# Altium project IoT_SYNTHPATCH.PrjPcb
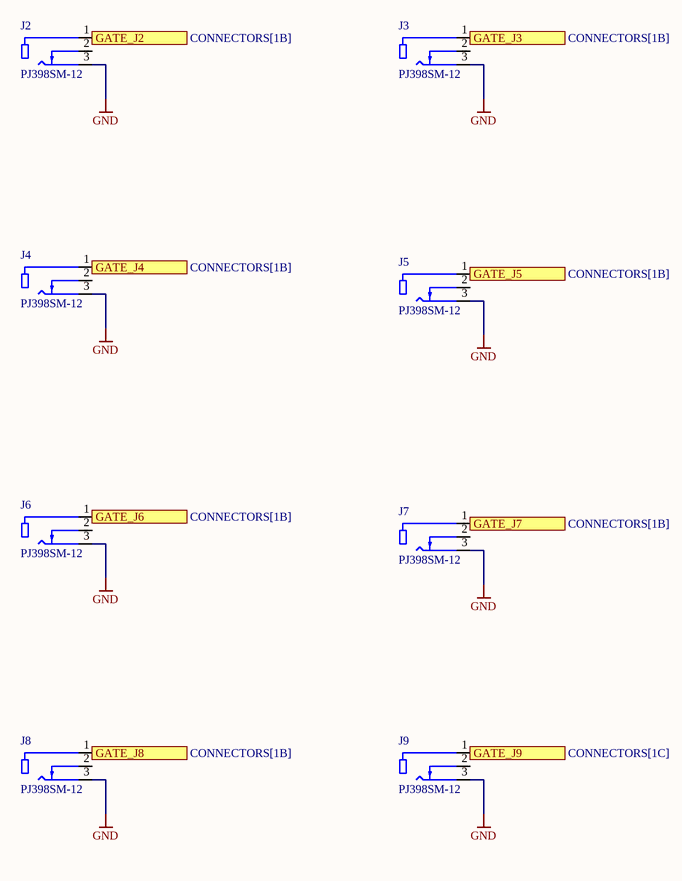
[diagram p0: INPUTS_GATES.SchDoc]
12 sheets, 198 parts. Net scope: flat (ports and power ports of the same name join across sheets).
Board file: IoT_SYNTHPATCH.PcbDoc
Sheets:
  INPUTS_GATES.SchDoc
  DAC_LFO.SchDoc
  DAC_VOCT.SchDoc
  Main.SchDoc
  MUTE_BUTTONS.SchDoc
  MIDI.SchDoc
  DISPLAY.SchDoc
  POWER.SchDoc
  ADC.SchDoc
  POWER_CONNECTOR.SchDoc
  MENU_BUTTONS.SchDoc
  CONNECTORS.SchDoc

## Sheet INPUTS_GATES.SchDoc
size A4; SheetNumber: 1; SheetTotal: 12

### Parts
J2  PJ398SM-12  [THONK_PJ398SM-12]
J3  PJ398SM-12  [THONK_PJ398SM-12]
J4  PJ398SM-12  [THONK_PJ398SM-12]
J5  PJ398SM-12  [THONK_PJ398SM-12]
J6  PJ398SM-12  [THONK_PJ398SM-12]
J7  PJ398SM-12  [THONK_PJ398SM-12]
J8  PJ398SM-12  [THONK_PJ398SM-12]
J9  PJ398SM-12  [THONK_PJ398SM-12]

### Ports
GATE_J2 (see CONNECTORS[1B]), GATE_J3 (see CONNECTORS[1B]), GATE_J4 (see CONNECTORS[1B]), GATE_J5 (see CONNECTORS[1B]), GATE_J6 (see CONNECTORS[1B]), GATE_J7 (see CONNECTORS[1B]), GATE_J8 (see CONNECTORS[1B]), GATE_J9 (see CONNECTORS[1C])

### Nets
GND: J2.3 J3.3 J4.3 J5.3 J6.3 J7.3 J8.3 J9.3
GATE_J2: J2.1 ; port GATE_J2
GATE_J3: J3.1 ; port GATE_J3
GATE_J4: J4.1 ; port GATE_J4
GATE_J5: J5.1 ; port GATE_J5
GATE_J6: J6.1 ; port GATE_J6
GATE_J7: J7.1 ; port GATE_J7
GATE_J8: J8.1 ; port GATE_J8
GATE_J9: J9.1 ; port GATE_J9

Not connected (* = marked no-connect by the designer): J2 2; J3 2; J4 2; J5 2; J6 2; J7 2; J8 2; J9 2

### Library data of the parts
J2-J9 = PJ398SM-12: 3.5mm Switching Jack Socket; MF: Thonk; Availability: Not in stock; Price: None; Package: Package; MP: PJ398SM-12; Value: *

## Sheet DAC_LFO.SchDoc
size A3; SheetNumber: 2; SheetTotal: 12
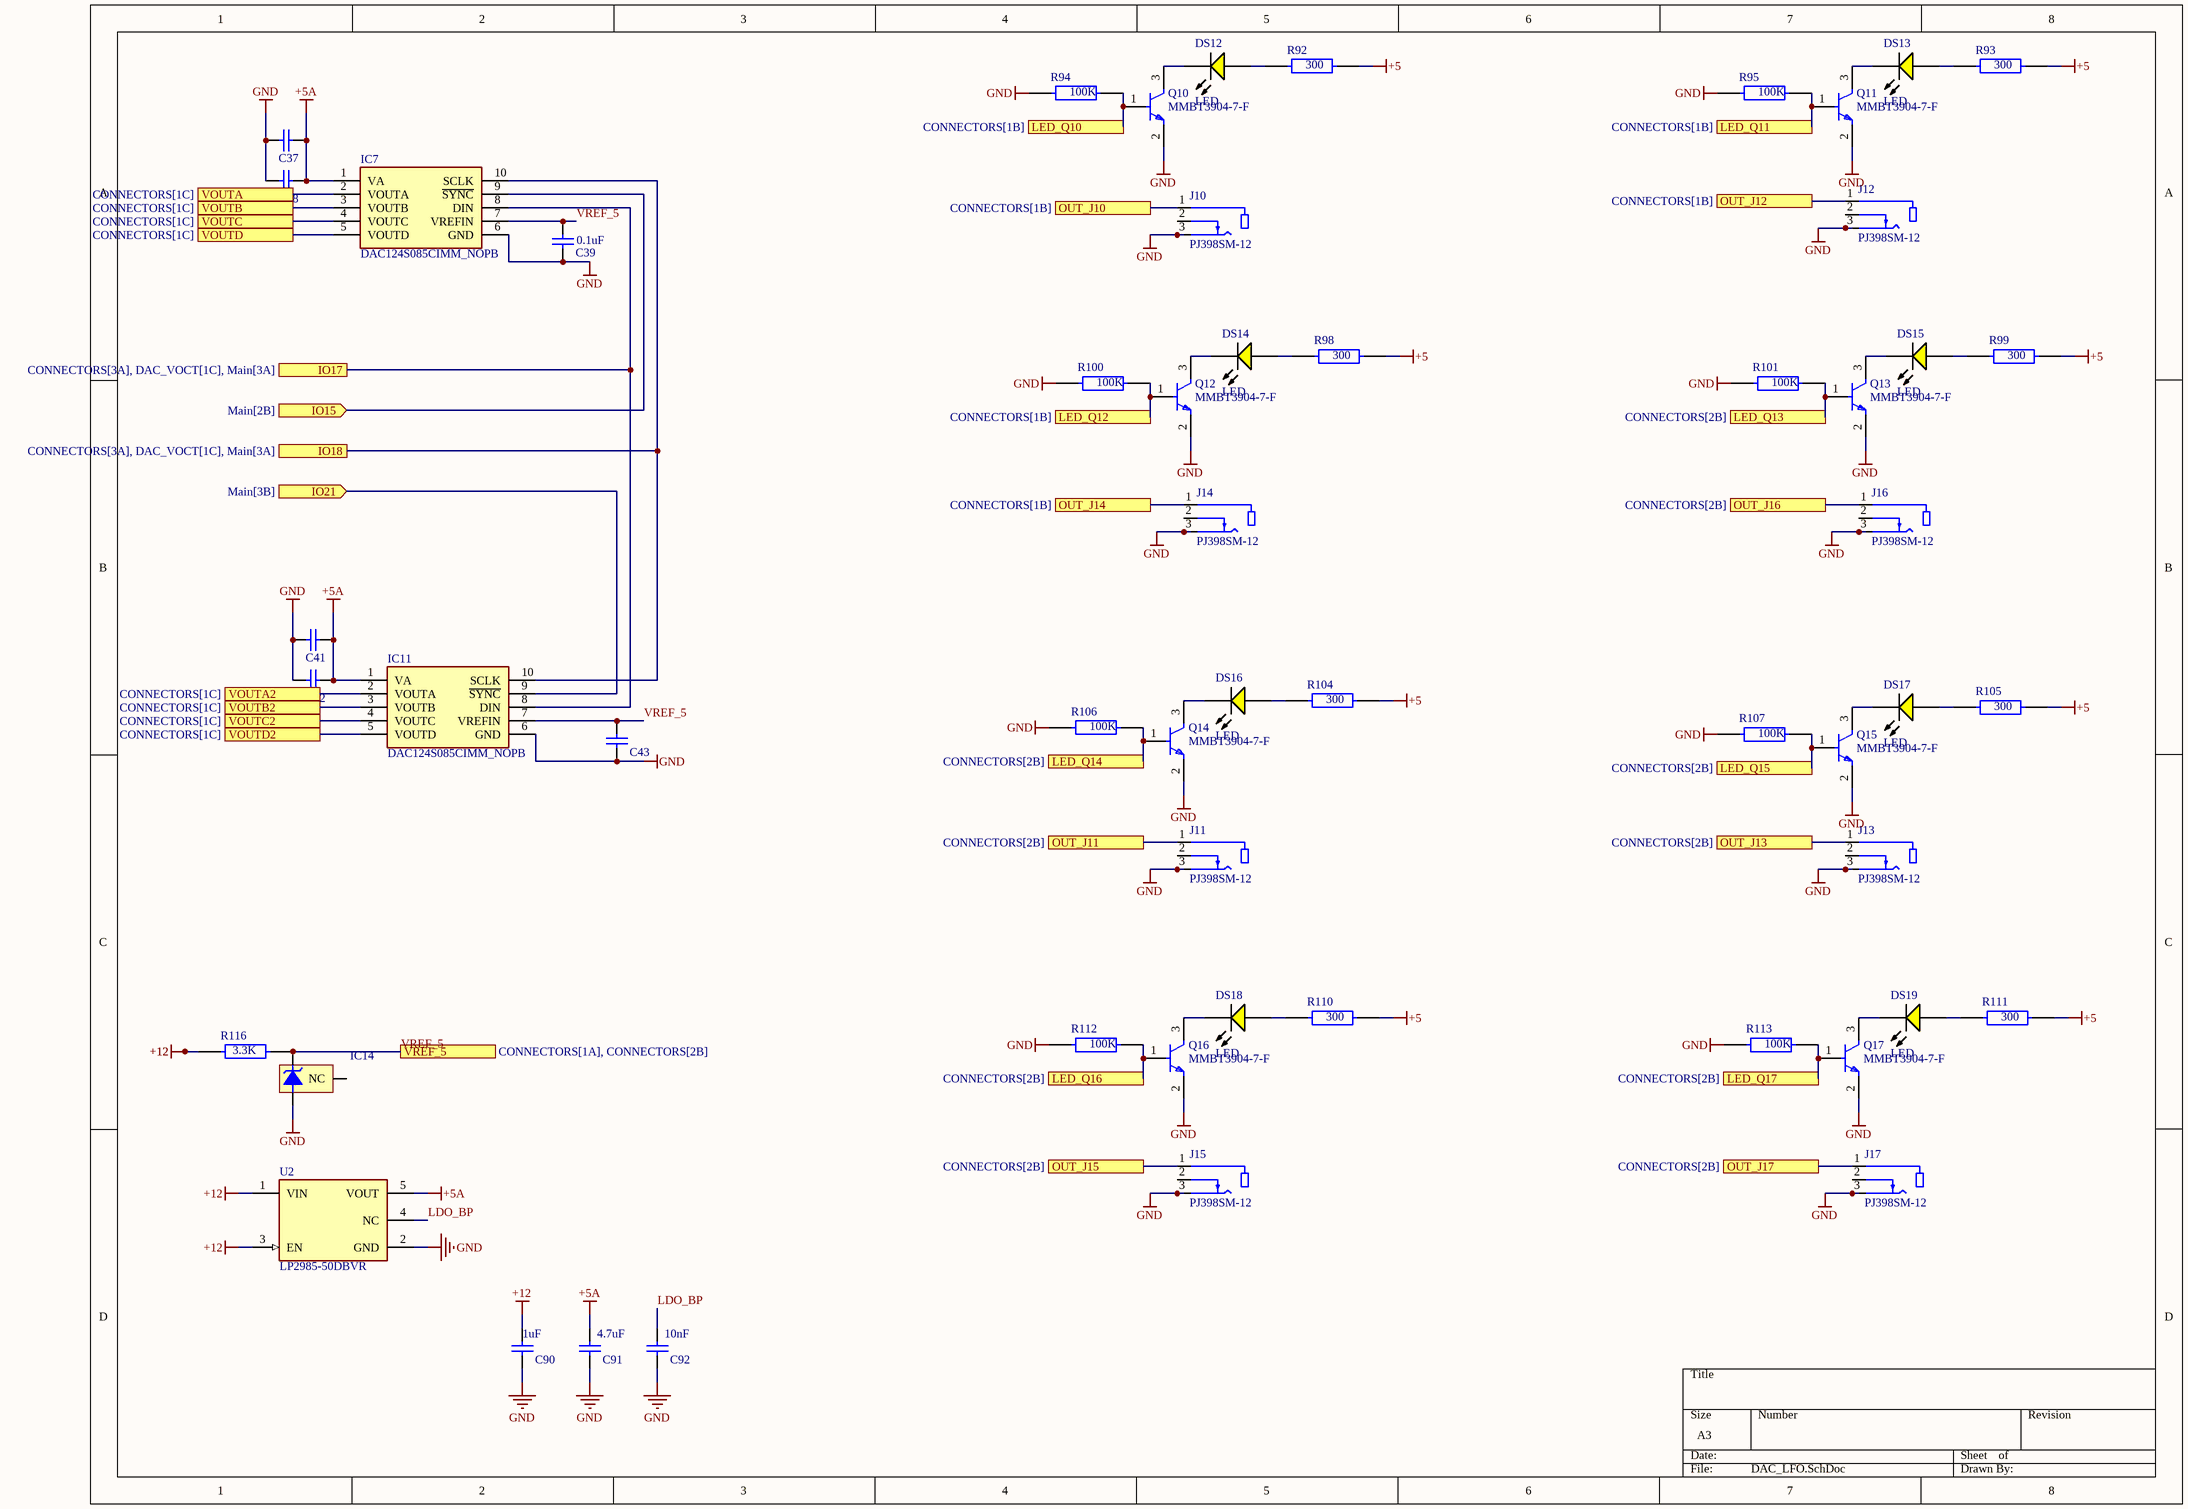
[diagram p1: DAC_LFO.SchDoc]

### Parts
C37  10uF  [CAPC2013X145X48NL20T23]  (value not drawn)
C38  0.1uF  [CAPC2013X145X48NL20T23]  (value not drawn)
C39  0.1uF  [CAPC2013X145X48NL20T23]
C41  10uF  [CAPC2013X145X48NL20T23]  (value not drawn)
C42  0.1uF  [CAPC2013X145X48NL20T23]  (value not drawn)
C43  0.1uF  [CAPC2013X145X48NL20T23]  (value not drawn)
C90  1uF  [CAPC2013X145X48NL20T23]
C91  4.7uF  [CAPC2013X145X48NL20T23]
C92  10nF  [CAPC2013X145X48NL20T23]
DS12  LED  [LED_SSL-LX4673GD-LA20]
DS13  LED  [LED_SSL-LX4673GD-LA20]
DS14  LED  [LED_SSL-LX4673GD-LA20]
DS15  LED  [LED_SSL-LX4673GD-LA20]
DS16  LED  [LED_SSL-LX4673GD-LA20]
DS17  LED  [LED_SSL-LX4673GD-LA20]
DS18  LED  [LED_SSL-LX4673GD-LA20]
DS19  LED  [LED_SSL-LX4673GD-LA20]
IC7  DAC124S085CIMM_NOPB  [SOP50P490X110-10N]
IC11  DAC124S085CIMM_NOPB  [SOP50P490X110-10N]
IC14  LM4040CEM3-5.0/NOPB  [MF03A_L]  (value not drawn)
J10  PJ398SM-12  [THONK_PJ398SM-12]
J11  PJ398SM-12  [THONK_PJ398SM-12]
J12  PJ398SM-12  [THONK_PJ398SM-12]
J13  PJ398SM-12  [THONK_PJ398SM-12]
J14  PJ398SM-12  [THONK_PJ398SM-12]
J15  PJ398SM-12  [THONK_PJ398SM-12]
J16  PJ398SM-12  [THONK_PJ398SM-12]
J17  PJ398SM-12  [THONK_PJ398SM-12]
Q10  MMBT3904-7-F  [3904-SOT23]
Q11  MMBT3904-7-F  [3904-SOT23]
Q12  MMBT3904-7-F  [3904-SOT23]
Q13  MMBT3904-7-F  [3904-SOT23]
Q14  MMBT3904-7-F  [3904-SOT23]
Q15  MMBT3904-7-F  [3904-SOT23]
Q16  MMBT3904-7-F  [3904-SOT23]
Q17  MMBT3904-7-F  [3904-SOT23]
R92  300  [FP-RN73R2A-IPC_A]
R93  300  [FP-RN73R2A-IPC_A]
R94  100K  [FP-RN73R2A-IPC_A]
R95  100K  [FP-RN73R2A-IPC_A]
R98  300  [FP-RN73R2A-IPC_A]
R99  300  [FP-RN73R2A-IPC_A]
R100  100K  [FP-RN73R2A-IPC_A]
R101  100K  [FP-RN73R2A-IPC_A]
R104  300  [FP-RN73R2A-IPC_A]
R105  300  [FP-RN73R2A-IPC_A]
R106  100K  [FP-RN73R2A-IPC_A]
R107  100K  [FP-RN73R2A-IPC_A]
R110  300  [FP-RN73R2A-IPC_A]
R111  300  [FP-RN73R2A-IPC_A]
R112  100K  [FP-RN73R2A-IPC_A]
R113  100K  [FP-RN73R2A-IPC_A]
R116  3.3K  [FP-RN73R2A-IPC_A]
U2  LP2985-50DBVR  [FP-SOT25-IPC_A]

### Ports
IO15 (in, see Main[2B]), IO17 (see CONNECTORS[3A], DAC_VOCT[1C], Main[3A]), IO18 (see CONNECTORS[3A], DAC_VOCT[1C], Main[3A]), IO21 (in, see Main[3B]), LED_Q10 (see CONNECTORS[1B]), LED_Q11 (see CONNECTORS[1B]), LED_Q12 (see CONNECTORS[1B]), LED_Q13 (see CONNECTORS[2B]), LED_Q14 (see CONNECTORS[2B]), LED_Q15 (see CONNECTORS[2B]), LED_Q16 (see CONNECTORS[2B]), LED_Q17 (see CONNECTORS[2B]), OUT_J10 (see CONNECTORS[1B]), OUT_J11 (see CONNECTORS[2B]), OUT_J12 (see CONNECTORS[1B]), OUT_J13 (see CONNECTORS[2B]), OUT_J14 (see CONNECTORS[1B]), OUT_J15 (see CONNECTORS[2B]), OUT_J16 (see CONNECTORS[2B]), OUT_J17 (see CONNECTORS[2B]), VOUTA2 (see CONNECTORS[1C]), VOUTA (see CONNECTORS[1C]), VOUTB2 (see CONNECTORS[1C]), VOUTB (see CONNECTORS[1C]), VOUTC2 (see CONNECTORS[1C]), VOUTC (see CONNECTORS[1C]), VOUTD2 (see CONNECTORS[1C]), VOUTD (see CONNECTORS[1C]), VREF_5 (see CONNECTORS[1A], CONNECTORS[2B])

### Nets
+5: R92.1 R93.1 R98.1 R99.1 R104.1 R105.1 R110.1 R111.1
+5A: C37.2 C38.2 C41.2 C42.2 C91.2 IC7.1(VA) IC11.1(VA) U2.5(VOUT)
+12: C90.2 R116.1 U2.1(VIN) U2.3(EN)
GND: C37.1 C38.1 C39.1 C41.1 C42.1 C43.1 C90.1 C91.1 C92.1 IC7.6(GND) IC11.6(GND) IC14.2(-V) J10.3 J11.3 J12.3 J13.3 J14.3 J15.3 J16.3 J17.3 Q10.2(E) Q11.2(E) Q12.2(E) Q13.2(E) Q14.2(E) Q15.2(E) Q16.2(E) Q17.2(E) R94.2 R95.2 R100.2 R101.2 R106.2 R107.2 R112.2 R113.2 U2.2(GND)
IO15: IC7.9(~{SYNC}) ; port IO15
IO17: IC7.8(DIN) IC11.8(DIN) ; port IO17
IO18: IC7.10(SCLK) IC11.10(SCLK) ; port IO18
IO21: IC11.9(~{SYNC}) ; port IO21
LDO_BP: C92.2 U2.4(NC)
LED_Q10: Q10.1(B) R94.1 ; port LED_Q10
LED_Q11: Q11.1(B) R95.1 ; port LED_Q11
LED_Q12: Q12.1(B) R100.1 ; port LED_Q12
LED_Q13: Q13.1(B) R101.1 ; port LED_Q13
LED_Q14: Q14.1(B) R106.1 ; port LED_Q14
LED_Q15: Q15.1(B) R107.1 ; port LED_Q15
LED_Q16: Q16.1(B) R112.1 ; port LED_Q16
LED_Q17: Q17.1(B) R113.1 ; port LED_Q17
OUT_J10: J10.1 ; port OUT_J10
OUT_J11: J11.1 ; port OUT_J11
OUT_J12: J12.1 ; port OUT_J12
OUT_J13: J13.1 ; port OUT_J13
OUT_J14: J14.1 ; port OUT_J14
OUT_J15: J15.1 ; port OUT_J15
OUT_J16: J16.1 ; port OUT_J16
OUT_J17: J17.1 ; port OUT_J17
VOUTA: IC7.2(VOUTA) ; port VOUTA
VOUTA2: IC11.2(VOUTA) ; port VOUTA2
VOUTB: IC7.3(VOUTB) ; port VOUTB
VOUTB2: IC11.3(VOUTB) ; port VOUTB2
VOUTC: IC7.4(VOUTC) ; port VOUTC
VOUTC2: IC11.4(VOUTC) ; port VOUTC2
VOUTD: IC7.5(VOUTD) ; port VOUTD
VOUTD2: IC11.5(VOUTD) ; port VOUTD2
VREF_5: C39.2 C43.2 IC7.7(VREFIN) IC11.7(VREFIN) IC14.1(+V) R116.2 ; port VREF_5
NetDS12_1: DS12.1(A) R92.2
NetDS12_2: DS12.2(K) Q10.3(C)
NetDS13_1: DS13.1(A) R93.2
NetDS13_2: DS13.2(K) Q11.3(C)
NetDS14_1: DS14.1(A) R98.2
NetDS14_2: DS14.2(K) Q12.3(C)
NetDS15_1: DS15.1(A) R99.2
NetDS15_2: DS15.2(K) Q13.3(C)
NetDS16_1: DS16.1(A) R104.2
NetDS16_2: DS16.2(K) Q14.3(C)
NetDS17_1: DS17.1(A) R105.2
NetDS17_2: DS17.2(K) Q15.3(C)
NetDS18_1: DS18.1(A) R110.2
NetDS18_2: DS18.2(K) Q16.3(C)
NetDS19_1: DS19.1(A) R111.2
NetDS19_2: DS19.2(K) Q17.3(C)

Not connected (* = marked no-connect by the designer): IC14 3(NC); J10 2; J11 2; J12 2; J13 2; J14 2; J15 2; J16 2; J17 2

### Library data of the parts
C37-C39 C41-C43 C90-C92 = CAP: Manufacturer: Vitramon; Part Number: VJ0805Y682KXAMT
DS12-DS19 = LED-Y: Through Hole Lamp, 2.1 V, -55 to 100 degC, 2-Pin THD, RoHS, Bulk; Luminous Intensity: 200 mcd; Illumination Colour: White; Power Rating: 78 mW; Viewing Angle: 140 degrees; Lens Style: Diffused; Nominal Vf: 3.6 V; Case\Package: 0603; Forward Current: 20 mA; Colour: White; Pins: 2; Mount: Surface Mount; Min Operating Temperature: -40 degC; Radiation Hardening: No; Width: 0.8 mm; PackageDescription: 2-Pin Through Hole Device, Dia 3.8 mm, Pitch 2.54 mm; REACH SVHC: No SVHC; DatasheetVersion: Rev. B, 07/2013; Max Operating Temperature: 85 degC; PackageReference: LTL-1CHYE; ComponentLink2URL: https://datasheet.ciiva.com/4269/s-110-ltl-1chye-4269126.pdf; ComponentLink1URL: http://www.us.liteon.com/; Case Code (Imperial): 0603; Height: 0.6 mm; Packaging: Tape and Reel; ComponentLink2Description: Datasheet; Length: 1.6 mm; Package Quantity: 4000; RoHSCompliant: true; ComponentLink1Description: Manufacturer URL; Case Code (Metric): 1608; Forward Voltage: 3.6 V
IC7 IC11 = DAC124S085CIMM_NOPB: 12-Bit Micro Power QUAD Digital-to-Analog Converter with Rail-to-Rail Output; Manufacturer_Name: Texas Instruments; Manufacturer_Part_Number: DAC124S085CIMM/NOPB; Geometry.Height: 1.1mm; Mouser Part Number: 926-DAC124S085CIMMNO; Mouser Price/Stock: https://www.mouser.co.uk/ProductDetail/Texas-Instruments/DAC124S085CIMM-NOPB?qs=7X5t%252BdzoRHBv34DgWfHrUA%3D%3D; Datasheet Link: http://www.ti.com/lit/gpn/dac124s085
IC14 = lm4040: Precision Micropower Shunt Voltage Reference, 3-pin SOT-23, Pb-Free; Manufacturer: National Semiconductor; PackageTopMarking: R5C*XTT; PowerWise: N; CompType: Voltage Reference IC; ComponentLink1URL: http://www.national.com/ds/LM/LM4040.pdf; PinCount: 3; ComponentLink2Description: LM4040 Web Page; ComponentLink3URL: http://www.national.com/packaging/folders/mf03a.html; RevisionNote: Component URLs added; PackageVersion: revB, Mar-2003; ComponentLink2URL: http://www.national.com/pf/LM/LM4040.html; ComponentLink3Description: MF03A Package Page; PackageReference: MF03A; RoHS: Y; DatasheetVersion: Apr-2005; PackageDescription: Molded SOT-23, .115 x .051 x .037in Body, 3 Lead, .075 in Pitch; ComponentLink1Description: LM4040 Datasheet
J10-J17 = PJ398SM-12: 3.5mm Switching Jack Socket; MF: Thonk; Availability: Not in stock; Price: None; Package: Package; MP: PJ398SM-12; Value: *
Q10-Q17 = 3904: TRANS NPN 40V 0.2A SMD SOT23-3; Frequency: 300MHz; Power Dissipation: 350mW; Element Configuration: Single; Max Power Dissipation: 300mW; Max Collector Current: 200mA; Collector Emitter Saturation Voltage: 300mV; Number of Elements: 1; hFE Min: 100; Collector Base Voltage (VCBO): 60V; Emitter Base Voltage (VEBO): 6V; Contact Plating: Tin; Package Quantity: 3000; Max Frequency: 300MHz; REACH SVHC: No SVHC; Max Operating Temperature: 150°C; Width: 1.4mm; Collector Emitter Voltage (VCEO): 40V; Voltage Rating (DC): 40V; Radiation Hardening: No; Case/Package: SOT-23; Height: 1mm; Collector Emitter Breakdown Voltage: 40V; Length: 3.05mm; Polarity: NPN; Packaging: Tape and Reel; Number of Pins: 3; Min Operating Temperature: -55°C; Gain Bandwidth Product: 300MHz; Mount: Surface Mount; Weight: 0.000282oz; Continuous Collector Current: 200mA; Transition Frequency: 300MHz; Max Breakdown Voltage: 40V; Lead Free: Lead Free
R92-R95 R98-R101 R104-R107 R110-R113 R116 = Resistor: RES 10K OHM 0.1% 1/8W 0805
U2 = CMP-12756-000035-1: Low-noise LDO 5.0 V 150 mA, SOT-23-5 (DAC supply +5A); Number of Regulators: 1; Output Current: 600mA; Output Type: Fixed; Polarity: Positive; Min Input Voltage: 2.5V; Output Voltage: 3.3V; Max Input Voltage: 6V; Accuracy: 1.5%; Quiescent Current: 55uA; Dropout Voltage: 250mV; Min Operating Temperature: -40°C; Length: 3.1mm; Max Operating Temperature: 85°C; Package Quantity: 1; Width: 1.7mm; Number of Outputs: 1; Packaging: Tape and Reel; Height: 1.3mm; Lead Free: Lead Free; Max Output Current: 600mA; Case/Package: SOT-23-5; Mount: Surface Mount; Number of Pins: 5

## Sheet DAC_VOCT.SchDoc
size A4; SheetNumber: 3; SheetTotal: 12
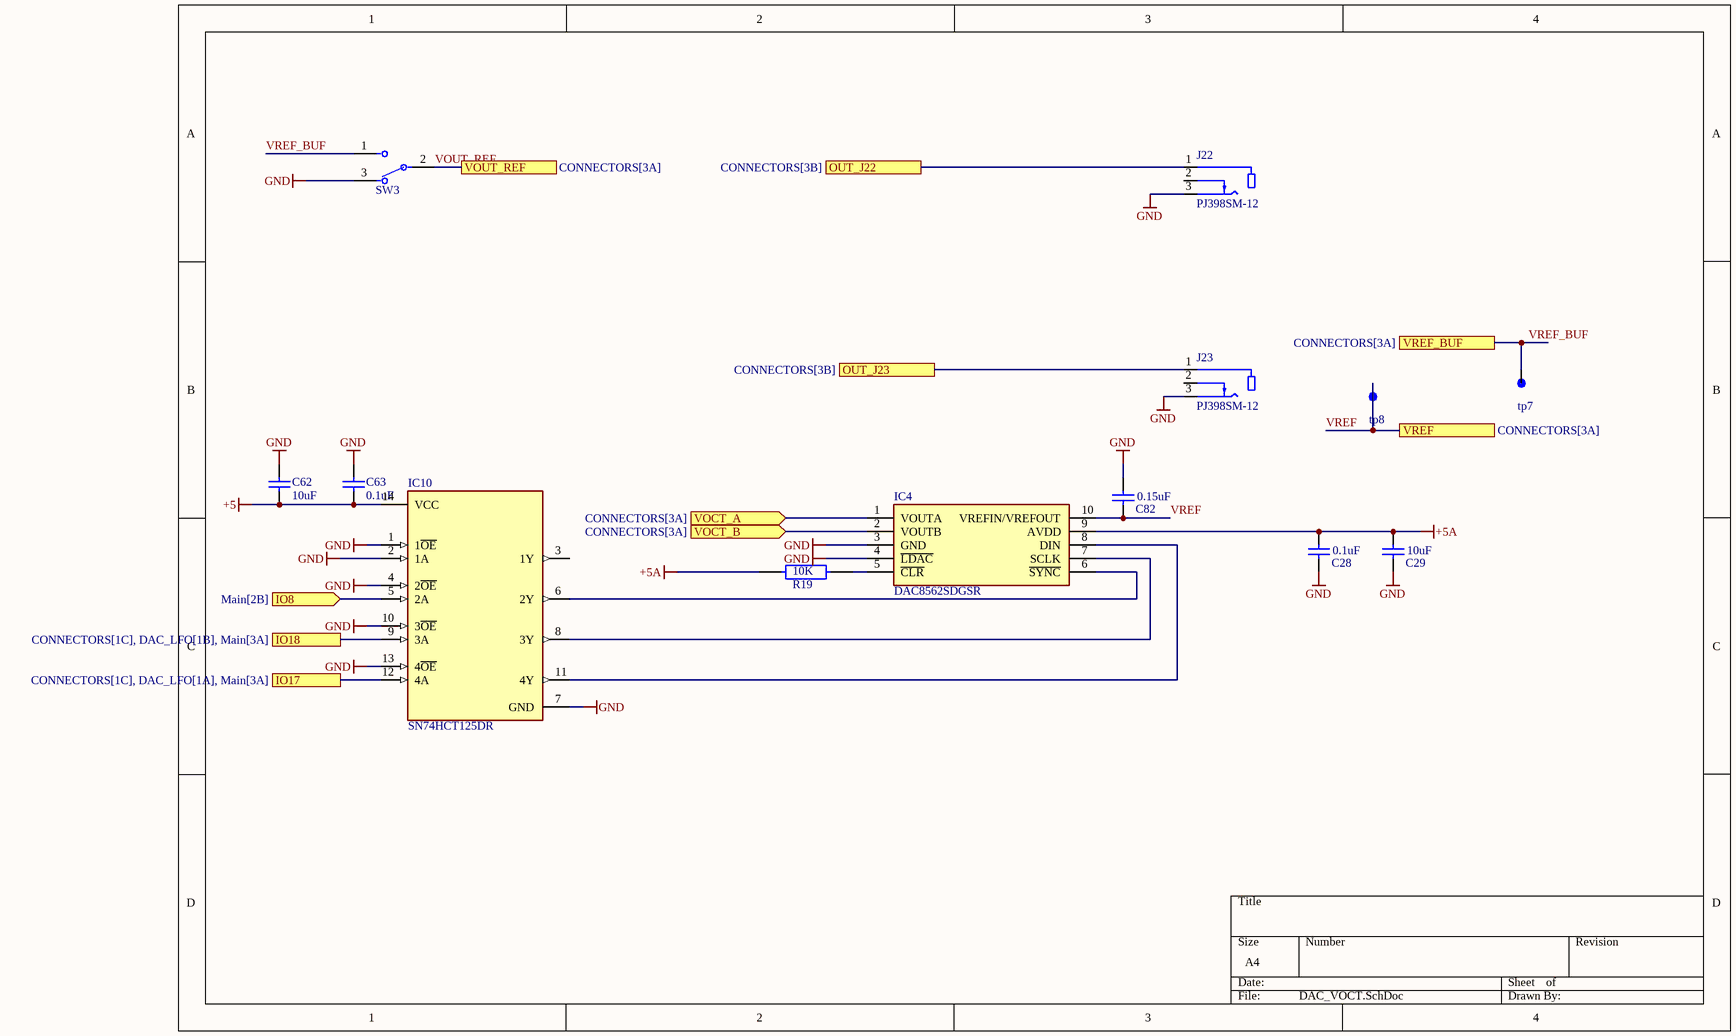
[diagram p2: DAC_VOCT.SchDoc]

### Parts
C28  0.1uF  [CAPC2013X145X48NL20T23]
C29  10uF  [CAPC2013X145X48NL20T23]
C62  10uF  [CAPC2013X145X48NL20T23]
C63  0.1uF  [CAPC2013X145X48NL20T23]
C82  0.15uF  [CAPC2013X145X48NL20T23]
IC4  DAC8562SDGSR  [SOP50P490X110-10N]
IC10  SN74HCT125DR  [FP-D0014A-IPC_B]
J22  PJ398SM-12  [THONK_PJ398SM-12]
J23  PJ398SM-12  [THONK_PJ398SM-12]
R19  10K  [FP-RN73R2A-IPC_A]
SW3  7101SD9CQE  [FP-7101SD9CQE-MFG]  (value not drawn)
tp7  Test point  [TP]  (value not drawn)
tp8  Test point  [TP]  (value not drawn)

### Ports
IO8 (in, see Main[2B]), IO17 (see CONNECTORS[1C], DAC_LFO[1A], Main[3A]), IO18 (see CONNECTORS[1C], DAC_LFO[1B], Main[3A]), OUT_J22 (see CONNECTORS[3B]), OUT_J23 (see CONNECTORS[3B]), VOCT_A (see CONNECTORS[3A]), VOCT_B (see CONNECTORS[3A]), VOUT_REF (see CONNECTORS[3A]), VREF (see CONNECTORS[3A]), VREF_BUF (see CONNECTORS[3A])

### Nets
+5: C62.2 C63.2 IC10.14(VCC)
+5A: C28.2 C29.2 IC4.9(AVDD) R19.2
GND: C28.1 C29.1 C62.1 C63.1 C82.2 IC4.3(GND) IC4.4(~{LDAC}) IC10.1(1~{OE}) IC10.2(1A) IC10.4(2~{OE}) IC10.7(GND) IC10.10(3~{OE}) IC10.13(4~{OE}) J22.3 J23.3 SW3.3
IO8: IC10.5(2A) ; port IO8
IO17: IC10.12(4A) ; port IO17
IO18: IC10.9(3A) ; port IO18
OUT_J22: J22.1 ; port OUT_J22
OUT_J23: J23.1 ; port OUT_J23
VOCT_A: IC4.1(VOUTA) ; port VOCT_A
VOCT_B: IC4.2(VOUTB) ; port VOCT_B
VOUT_REF: SW3.2(COMM) ; port VOUT_REF
VREF: C82.1 IC4.10(VREFIN/VREFOUT) tp8.1 ; port VREF
VREF_BUF: SW3.1 tp7.1 ; port VREF_BUF
NetIC4_5: IC4.5(~{CLR}) R19.1
NetIC4_6: IC4.6(~{SYNC}) IC10.6(2Y)
NetIC4_7: IC4.7(SCLK) IC10.8(3Y)
NetIC4_8: IC4.8(DIN) IC10.11(4Y)

Not connected (* = marked no-connect by the designer): IC10 3(1Y); J22 2; J23 2

### Library data of the parts
C28 C29 C62 C63 C82 = CAP: as C37 on sheet DAC_LFO
IC4 = DAC8562SDGSR: 16-bit, dual-channel, low-power, ultra-low glitch, voltage output DAC with 2.5V, 4ppm/C reference; Manufacturer_Name: Texas Instruments; Geometry.Height: 1.1mm; Mouser Part Number: 595-DAC8562SDGSR; Mouser Price/Stock: https://www.mouser.co.uk/ProductDetail/Texas-Instruments/DAC8562SDGSR?qs=L4ss%2FyqpMWQjhHzbOFnTNg%3D%3D; Manufacturer_Part_Number: DAC8562SDGSR; Datasheet Link: http://www.ti.com/lit/gpn/dac8562
IC10 = 74HCT125: IC BUF NON-INVERT 5.5V 14SOIC; Number of Input Lines: 4; Polarity: Non-Inverting; Logic Function: Buffer; Low Level Output Current: 6mA; Operating Supply Voltage: 5V; Min Supply Voltage: 4.5V; Quiescent Current: 8uA; Propagation Delay: 50ns; Number of Bits per Element: 1; High Level Output Current: -6mA; Turn-On Delay Time: 36ns; Width: 3.91mm; Max Supply Voltage: 5.5V; Number of Circuits: 4; Max Operating Temperature: 85°C; Radiation Hardening: No; Number of Outputs: 4; Case/Package: SOIC; Length: 8.65mm; Number of Output Lines: 4; Number of Pins: 14; Package Quantity: 2500; Number of Inputs: 4; Mount: Surface Mount; Min Operating Temperature: -40°C; Number of Bits: 4; REACH SVHC: No SVHC; Height: 1.58mm; Contact Plating: Gold; Lead Free: Lead Free; Number of Channels: 4; Number of Elements: 4; Packaging: Tape and Reel; RoHS Compliant: Yes
J22 J23 = PJ398SM-12: 3.5mm Switching Jack Socket; MF: Thonk; Availability: Not in stock; Price: None; Package: Package; MP: PJ398SM-12; Value: *
R19 = Resistor: RES 10K OHM 0.1% 1/8W 0805
SW3 = SPDT: 7101SD9CQE Toggle Switch, Spdt, On-On, Maintained, 5A, 28Vdc, 3 Pcb Hole Cnt, Solder Terminal, Toggle; NexarPartId: 55410166; Voltage Rating (AC): 120V; Max Voltage Rating (DC): 28V; Illumination Type: Illuminated, Non-Illuminated; Contact Resistance: 10mΩ; Actuator Material: Brass, Chrome; Life (Cycles): 100kcycles; Max Voltage Rating (AC): 250V; Actuator Length: 12.45mm; Max Current Rating: 5A; Contact Current Rating: 5A; Termination: PC Pins; Min Operating Temperature: -30°C; Depth: 6.86mm; Orientation: Straight; Voltage Rating (DC): 28V; Length: 12.7mm; RoHS: Compliant; Housing Material: Stainless Steel; Contact Material: Silver; Contact Plating: Silver; Radiation Hardening: No; Current Rating: 5A; Lead Free: Lead Free; Switch Function: On-On; Mount: Through Hole; Electrical Life: 100kcycles; Throw Configuration: SPDT; Max Operating Temperature: 85°C
tp7 tp8 = Testpoint: Value: Test point

## Sheet Main.SchDoc
size A4; SheetNumber: 4; SheetTotal: 12
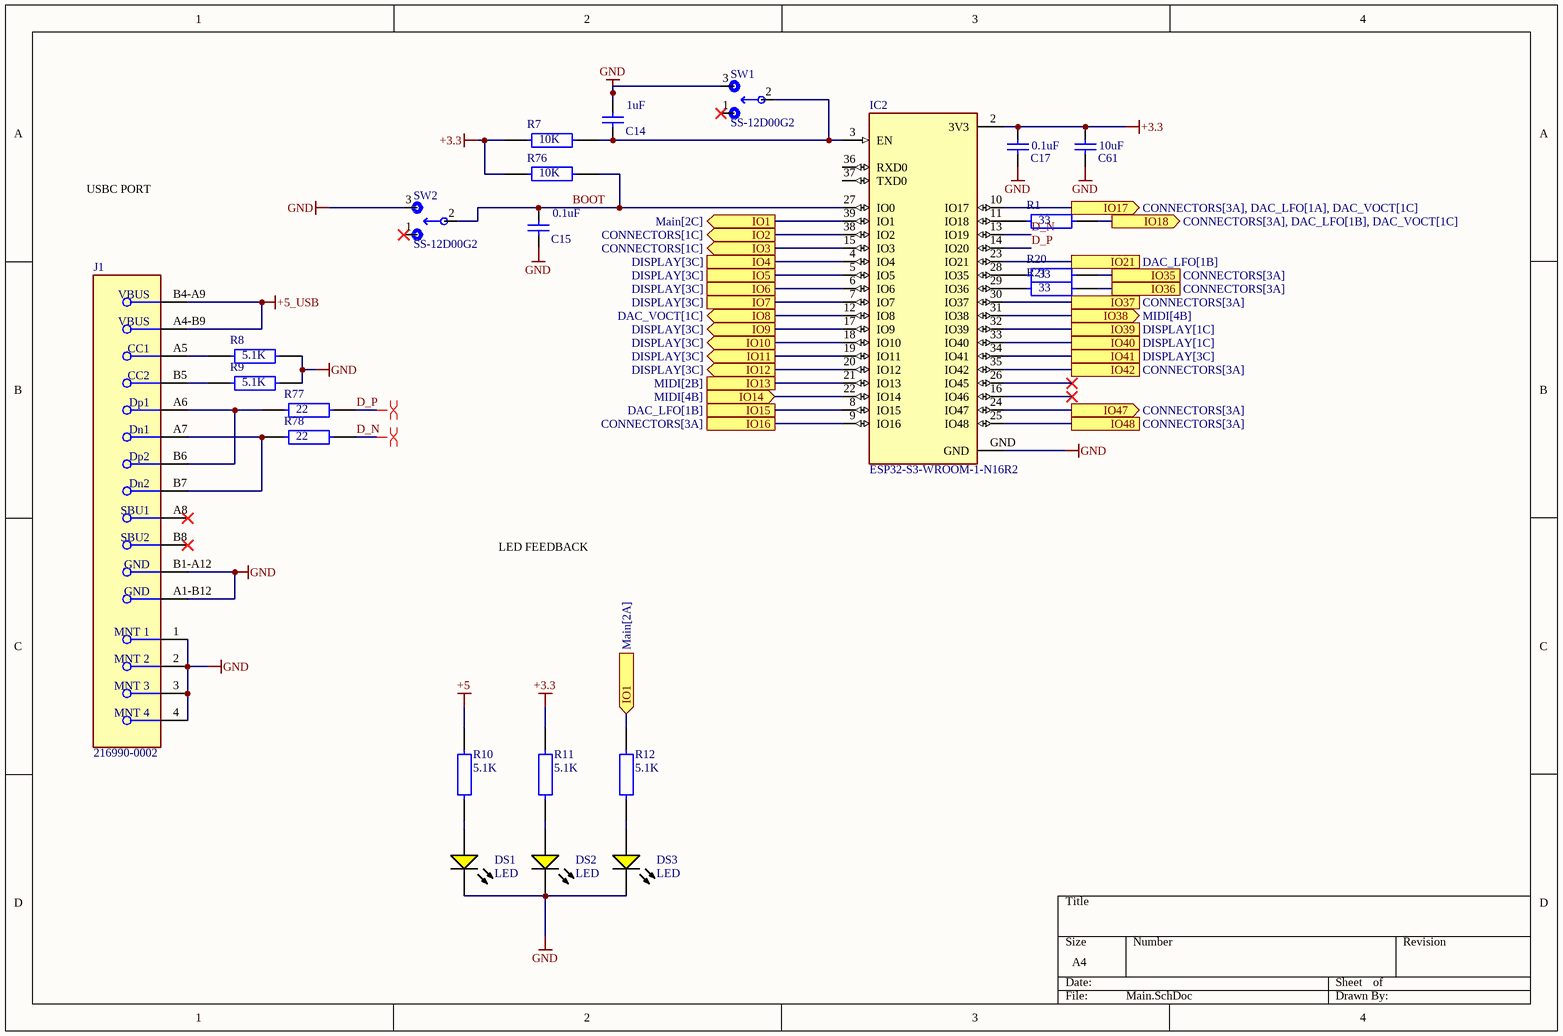
[diagram p3: Main.SchDoc]

### Parts
C14  1uF  [CAPC2013X145X48NL20T23]
C15  0.1uF  [CAPC2013X145X48NL20T23]
C17  0.1uF  [CAPC2013X145X48NL20T23]
C61  10uF  [CAPC2013X145X48NL20T23]
DS1  LED  [LED_0805]
DS2  LED  [LED_0805]
DS3  LED  [LED_0805]
IC2  ESP32-S3-WROOM-1-N16R2  [XCVR_ESP32-S3-WROOM-1-N16R2]
J1  216990-0002  [FP-216990-0002-MFG]
R1  33  [FP-RN73R2A-IPC_A]
R7  10K  [FP-RN73R2A-IPC_A]
R8  5.1K  [FP-RN73R2A-IPC_A]
R9  5.1K  [FP-RN73R2A-IPC_A]
R10  5.1K  [FP-RN73R2A-IPC_A]
R11  5.1K  [FP-RN73R2A-IPC_A]
R12  5.1K  [FP-RN73R2A-IPC_A]
R20  33  [FP-RN73R2A-IPC_A]
R21  33  [FP-RN73R2A-IPC_A]
R76  10K  [FP-RN73R2A-IPC_A]
R77  22  [FP-RN73R2A-IPC_A]
R78  22  [FP-RN73R2A-IPC_A]
SW1  SS-12D00G2  [SS12D00_SPDT]
SW2  SS-12D00G2  [SS12D00_SPDT]

### Ports
IO1 (in, see Main[2A]), IO1 (out, see Main[2C]), IO2 (out, see CONNECTORS[1C]), IO3 (out, see CONNECTORS[1C]), IO4 (see DISPLAY[3C]), IO5 (see DISPLAY[3C]), IO6 (see DISPLAY[3C]), IO7 (see DISPLAY[3C]), IO8 (out, see DAC_VOCT[1C]), IO9 (out, see DISPLAY[3C]), IO10 (out, see DISPLAY[3C]), IO11 (out, see DISPLAY[3C]), IO12 (out, see DISPLAY[3C]), IO13 (see MIDI[2B]), IO14 (in, see MIDI[4B]), IO15 (see DAC_LFO[1B]), IO16 (see CONNECTORS[3A]), IO17 (out, see CONNECTORS[3A], DAC_LFO[1A], DAC_VOCT[1C]), IO18 (out, see CONNECTORS[3A], DAC_LFO[1B], DAC_VOCT[1C]), IO21 (see DAC_LFO[1B]), IO35 (see CONNECTORS[3A]), IO36 (see CONNECTORS[3A]), IO37 (see CONNECTORS[3A]), IO38 (out, see MIDI[4B]), IO39 (see DISPLAY[1C]), IO40 (see DISPLAY[1C]), IO41 (see DISPLAY[3C]), IO42 (see CONNECTORS[3A]), IO47 (out, see CONNECTORS[3A]), IO48 (see CONNECTORS[3A])

### Nets
+3.3: C17.2 C61.2 IC2.2(3V3) R7.2 R11.1 R76.2
+5: R10.1
+5_USB: J1.A4-B9(VBUS) J1.B4-A9(VBUS)
GND: C14.2 C15.1 C17.1 C61.1 DS1.2(K) DS2.2(K) DS3.2(K) IC2.GND J1.1(MNT_1) J1.2(MNT_2) J1.3(MNT_3) J1.4(MNT_4) J1.A1-B12(GND) J1.B1-A12(GND) R8.1 R9.1 SW1.3 SW2.3
BOOT: C15.2 IC2.27(IO0) R76.1 SW2.2
D_N: IC2.13(IO19) R78.1
D_P: IC2.14(IO20) R77.1
IO1: IC2.39(IO1) R12.1 ; port IO1
IO2: IC2.38(IO2) ; port IO2
IO3: IC2.15(IO3) ; port IO3
IO4: IC2.4(IO4) ; port IO4
IO5: IC2.5(IO5) ; port IO5
IO6: IC2.6(IO6) ; port IO6
IO7: IC2.7(IO7) ; port IO7
IO8: IC2.12(IO8) ; port IO8
IO9: IC2.17(IO9) ; port IO9
IO10: IC2.18(IO10) ; port IO10
IO11: IC2.19(IO11) ; port IO11
IO12: IC2.20(IO12) ; port IO12
IO13: IC2.21(IO13) ; port IO13
IO14: IC2.22(IO14) ; port IO14
IO15: IC2.8(IO15) ; port IO15
IO16: IC2.9(IO16) ; port IO16
IO17: IC2.10(IO17) ; port IO17
IO18: R1.1 ; port IO18
IO21: IC2.23(IO21) ; port IO21
IO35: R20.1 ; port IO35
IO36: R21.1 ; port IO36
IO37: IC2.30(IO37) ; port IO37
IO38: IC2.31(IO38) ; port IO38
IO39: IC2.32(IO39) ; port IO39
IO40: IC2.33(IO40) ; port IO40
IO41: IC2.34(IO41) ; port IO41
IO42: IC2.35(IO42) ; port IO42
IO47: IC2.24(IO47) ; port IO47
IO48: IC2.25(IO48) ; port IO48
NetC14_1: C14.1 IC2.3(EN) R7.1 SW1.2
NetDS1_1: DS1.1(A) R10.2
NetDS2_1: DS2.1(A) R11.2
NetDS3_1: DS3.1(A) R12.2
NetIC2_11: IC2.11(IO18) R1.2
NetIC2_28: IC2.28(IO35) R20.2
NetIC2_29: IC2.29(IO36) R21.2
NetJ1_A5: J1.A5(CC1) R8.2
NetJ1_A6: J1.A6(Dp1) J1.B6(Dp2) R77.2
NetJ1_A7: J1.A7(Dn1) J1.B7(Dn2) R78.2
NetJ1_B5: J1.B5(CC2) R9.2

Not connected (* = marked no-connect by the designer): IC2 16(IO46)* 26(IO45)* 36(RXD0) 37(TXD0); J1 A8(SBU1)* B8(SBU2)*; SW1 1*; SW2 1*

### Layout directives
differential pair: D_N, D_P

### Notes on the sheet
- USBC PORT
- LED FEEDBACK

### Library data of the parts
C14 C15 C17 C61 = CAP: as C37 on sheet DAC_LFO
DS1-DS3 = CMP-1674-00012-1: Through Hole Lamp, 2.1 V, -55 to 100 degC, 2-Pin THD, RoHS, Bulk; Luminous Intensity: 200 mcd; Illumination Colour: White; Power Rating: 78 mW; Viewing Angle: 140 degrees; Lens Style: Diffused; Nominal Vf: 3.6 V; Case\Package: 0603; Forward Current: 20 mA; Colour: White; Pins: 2; Mount: Surface Mount; Min Operating Temperature: -40 degC; Radiation Hardening: No; Width: 0.8 mm; PackageDescription: 2-Pin Through Hole Device, Dia 3.8 mm, Pitch 2.54 mm; REACH SVHC: No SVHC; DatasheetVersion: Rev. B, 07/2013; Max Operating Temperature: 85 degC; PackageReference: LTL-1CHYE; ComponentLink2URL: https://datasheet.ciiva.com/4269/s-110-ltl-1chye-4269126.pdf; ComponentLink1URL: http://www.us.liteon.com/; Case Code (Imperial): 0603; Height: 0.6 mm; Packaging: Tape and Reel; ComponentLink2Description: Datasheet; Length: 1.6 mm; Package Quantity: 4000; RoHSCompliant: true; ComponentLink1Description: Manufacturer URL; Case Code (Metric): 1608; Forward Voltage: 3.6 V
IC2 = ESP32-S3-WROOM-1-N16R2: Bluetooth, WiFi 802.11b/g/n, Bluetooth v5.0 Transceiver Module 2.4GHz PCB Trace Surface Mount; MF: Espressif Systems; MP: ESP32S3WROOM1N16R2; SnapEDA_Link: https://www.snapeda.com/parts/ESP32S3WROOM1N16R2/Espressif+Systems/view-part/?ref=snap; Package: NON STANDARD Espressif Systems; Value: *; Check_prices: https://www.snapeda.com/parts/ESP32S3WROOM1N16R2/Espressif+Systems/view-part/?ref=eda
J1 = USBC16: CONN RCP USB2.0 TYP C 24P SMD RA
R1 R7-R12 R20 R21 R76-R78 = Resistor: RES 10K OHM 0.1% 1/8W 0805
SW1 SW2 = Switch: Switch Slide ON ON SPDT Side Slide 0.1A 12VDC 10000Cycles PC Pins Bracket Mount/Through Hole Bulk; MF: Littelfuse/C&K; MP: OS102011MA1QN1; SnapEDA_Link: https://www.snapeda.com/parts/OS102011MA1QN1/Littelfuse/view-part/?ref=snap; Package: None; Value: *; Check_prices: https://www.snapeda.com/parts/OS102011MA1QN1/Littelfuse/view-part/?ref=eda

## Sheet MUTE_BUTTONS.SchDoc
size A4; SheetNumber: 5; SheetTotal: 12
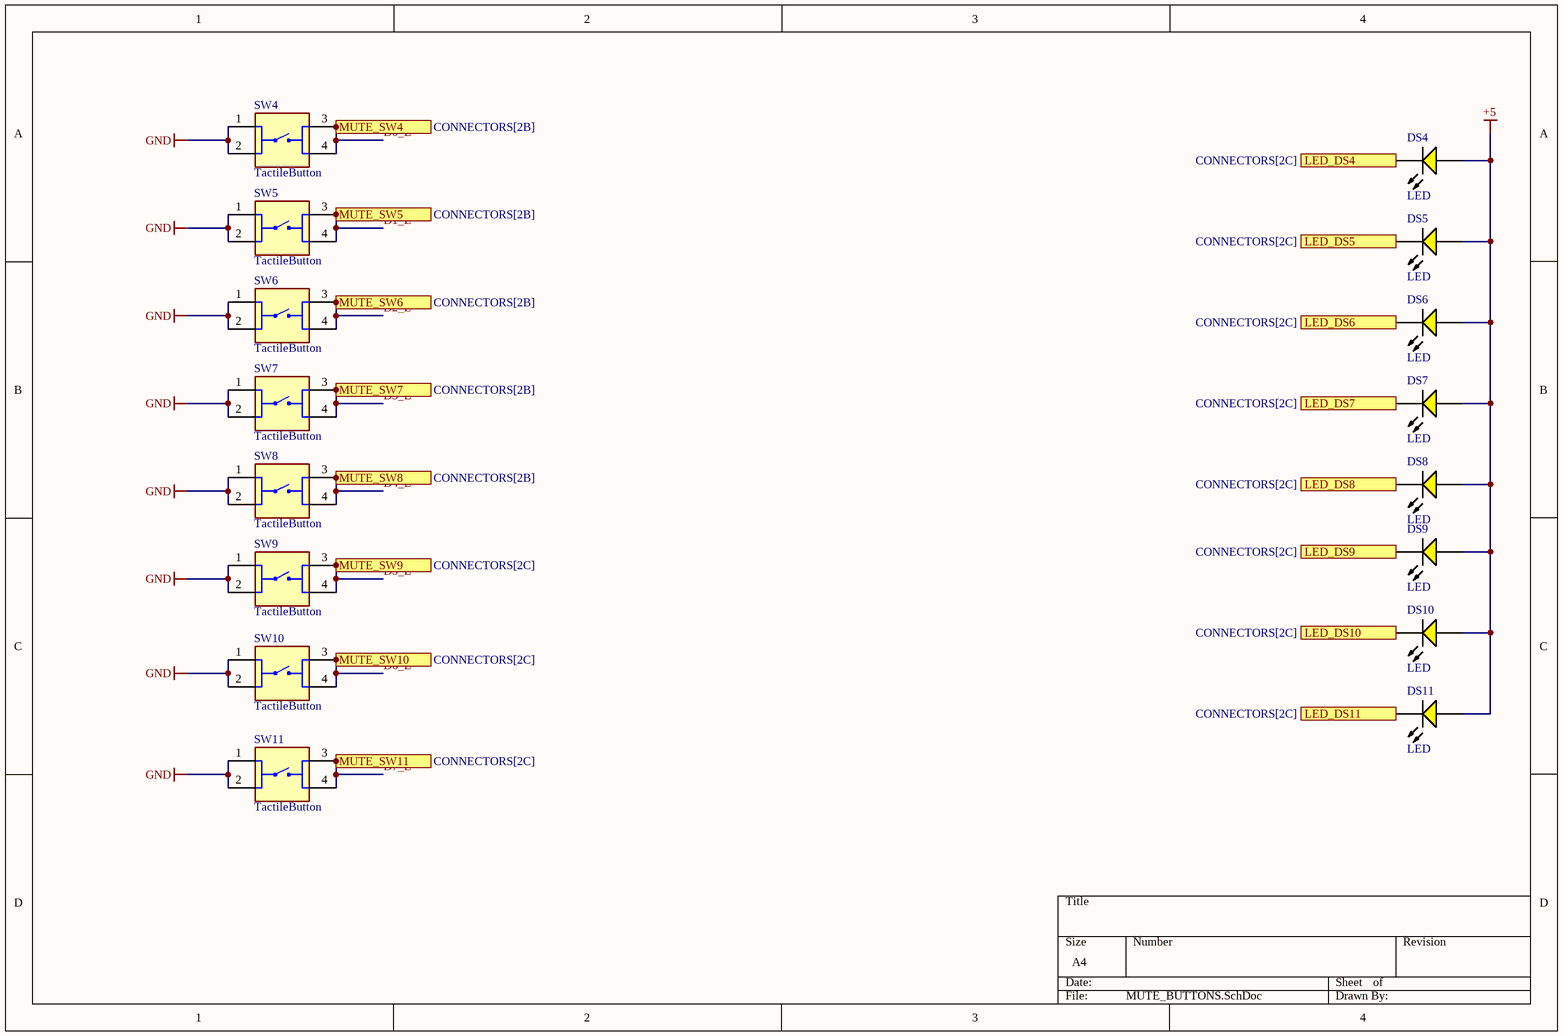
[diagram p4: MUTE_BUTTONS.SchDoc]

### Parts
DS4  LED  [LED_SSL-LX4673GD-LA20]
DS5  LED  [LED_SSL-LX4673GD-LA20]
DS6  LED  [LED_SSL-LX4673GD-LA20]
DS7  LED  [LED_SSL-LX4673GD-LA20]
DS8  LED  [LED_SSL-LX4673GD-LA20]
DS9  LED  [LED_SSL-LX4673GD-LA20]
DS10  LED  [LED_SSL-LX4673GD-LA20]
DS11  LED  [LED_SSL-LX4673GD-LA20]
SW4  TactileButton  [SW_1825910-6-4]
SW5  TactileButton  [SW_1825910-6-4]
SW6  TactileButton  [SW_1825910-6-4]
SW7  TactileButton  [SW_1825910-6-4]
SW8  TactileButton  [SW_1825910-6-4]
SW9  TactileButton  [SW_1825910-6-4]
SW10  TactileButton  [SW_1825910-6-4]
SW11  TactileButton  [SW_1825910-6-4]

### Ports
LED_DS4 (see CONNECTORS[2C]), LED_DS5 (see CONNECTORS[2C]), LED_DS6 (see CONNECTORS[2C]), LED_DS7 (see CONNECTORS[2C]), LED_DS8 (see CONNECTORS[2C]), LED_DS9 (see CONNECTORS[2C]), LED_DS10 (see CONNECTORS[2C]), LED_DS11 (see CONNECTORS[2C]), MUTE_SW4 (see CONNECTORS[2B]), MUTE_SW5 (see CONNECTORS[2B]), MUTE_SW6 (see CONNECTORS[2B]), MUTE_SW7 (see CONNECTORS[2B]), MUTE_SW8 (see CONNECTORS[2B]), MUTE_SW9 (see CONNECTORS[2C]), MUTE_SW10 (see CONNECTORS[2C]), MUTE_SW11 (see CONNECTORS[2C])

### Nets
+5: DS4.1(A) DS5.1(A) DS6.1(A) DS7.1(A) DS8.1(A) DS9.1(A) DS10.1(A) DS11.1(A)
GND: SW4.1 SW4.2 SW5.1 SW5.2 SW6.1 SW6.2 SW7.1 SW7.2 SW8.1 SW8.2 SW9.1 SW9.2 SW10.1 SW10.2 SW11.1 SW11.2
D0_L: SW4.3 SW4.4 ; port MUTE_SW4
D1_L: SW5.3 SW5.4 ; port MUTE_SW5
D2_L: SW6.3 SW6.4 ; port MUTE_SW6
D3_L: SW7.3 SW7.4 ; port MUTE_SW7
D4_L: SW8.3 SW8.4 ; port MUTE_SW8
D5_L: SW9.3 SW9.4 ; port MUTE_SW9
D6_L: SW10.3 SW10.4 ; port MUTE_SW10
D7_L: SW11.3 SW11.4 ; port MUTE_SW11
LED_DS4: DS4.2(K) ; port LED_DS4
LED_DS5: DS5.2(K) ; port LED_DS5
LED_DS6: DS6.2(K) ; port LED_DS6
LED_DS7: DS7.2(K) ; port LED_DS7
LED_DS8: DS8.2(K) ; port LED_DS8
LED_DS9: DS9.2(K) ; port LED_DS9
LED_DS10: DS10.2(K) ; port LED_DS10
LED_DS11: DS11.2(K) ; port LED_DS11

### Library data of the parts
DS4-DS11 = LED-Y: as DS12 on sheet DAC_LFO; Colour: White; Pins: 2; Mount: Surface Mount; Min Operating Temperature: -40 degC; Radiation Hardening: No; Width: 0.8 mm; PackageDescription: 2-Pin Through Hole Device, Dia 3.8 mm, Pitch 2.54 mm; REACH SVHC: No SVHC; DatasheetVersion: Rev. B, 07/2013; Max Operating Temperature: 85 degC; PackageReference: LTL-1CHYE; ComponentLink2URL: https://datasheet.ciiva.com/4269/s-110-ltl-1chye-4269126.pdf; ComponentLink1URL: http://www.us.liteon.com/; Case Code (Imperial): 0603; Height: 0.6 mm; Packaging: Tape and Reel; ComponentLink2Description: Datasheet; Length: 1.6 mm; Package Quantity: 4000; RoHSCompliant: true; ComponentLink1Description: Manufacturer URL; Case Code (Metric): 1608; Forward Voltage: 3.6 V
SW4-SW11 = TactileButton: FSM4JH=6MM TACT SWITCH, HIGH TEMP; MF: TE Connectivity; MP: 1825910-6; SnapEDA_Link: https://www.snapeda.com/parts/1825910-6/TE+Connectivity+Alcoswitch+Switches/view-part/?ref=snap; Package: None; Value: *; Check_prices: https://www.snapeda.com/parts/1825910-6/TE+Connectivity+Alcoswitch+Switches/view-part/?ref=eda

## Sheet MIDI.SchDoc
size A4; SheetNumber: 6; SheetTotal: 12
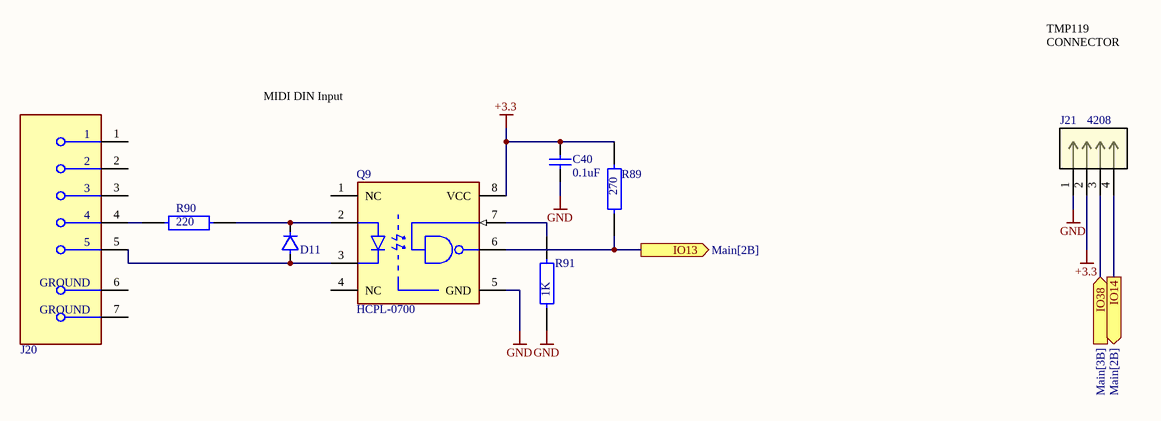
[diagram p5: MIDI.SchDoc]

### Parts
C40  0.1uF  [0805-hs]
D11  1N4148WS  [4148]  (value not drawn)
J20  PJ366ST  [THONK_PJ366ST_MIDI_TRS]  (value not drawn)
J21  4208  [CONN_CCSH-W10R-04TR-BK-A_ADA]
Q9  HCPL-0700  [D8_N]
R89  270  [0805-hs]
R90  220  [0805-hs]
R91  1K  [0805-hs]

### Ports
IO13 (out, see Main[2B]), IO14 (out, see Main[2B]), IO38 (in, see Main[3B])

### Nets
+3.3: C40.2 J21.2 Q9.8(VCC) R89.2
GND: C40.1 J21.1 Q9.5(GND) R91.1
IO13: Q9.6(VO) R89.1 ; port IO13
IO14: J21.4 ; port IO14
IO38: J21.3 ; port IO38
NetD11_1: D11.1(C) Q9.2(A) R90.2
NetD11_2: D11.2(A) J20.5 Q9.3(C)
NetJ20_4: J20.4 R90.1
NetQ9_7: Q9.7(VE) R91.2

Not connected (* = marked no-connect by the designer): J20 1 2 3 6(GROUND) 7(GROUND); Q9 1(NC) 4(NC)

### Notes on the sheet
- TMP119 CONNECTOR
- MIDI DIN Input

### Library data of the parts
C40 = CAP-np: Manufacturer: Vitramon; Part Number: VJ0805Y682KXAMT
D11 = 4148WS: DIODE GEN PURP 75V 150MA SOD323F; Forward Voltage: 1V; Power Dissipation: 200mW; Element Configuration: Single; Max Forward Surge Current (Ifsm): 2A; Peak Reverse Current: 5uA; Recovery Time: 4ns; Package Quantity: 1; Number of Pins: 2; Height: 1mm; REACH SVHC: No SVHC; Max Reverse Voltage (DC): 75V; Forward Current: 150mA; Length: 1.8mm; Max Repetitive Reverse Voltage (Vrrm): 75V; Max Operating Temperature: 150°C; Average Rectified Current: 150mA; Contact Plating: Tin; Packaging: Tape and Reel; Radiation Hardening: No; Min Operating Temperature: -55°C; Width: 1.35mm; Weight: 0.0276g; Lead Free: Lead Free; Mount: Surface Mount; Reverse Voltage: 75V; Reverse Recovery Time: 4ns
J20 = MIDI_connector: 3.5mm TRS jack (stereo Thonkiconn PJ366ST), MIDI TRS Type A: tip=5, ring=4, sleeve=2; Number of Contacts: 5; Gender: Female; Current Rating: 3A; Voltage Rating: 34V; Strain Relief: No (Without); Number of Ports: 1; Connector Type: Receptacle; Body Material: Metal; RoHS Compliant: Yes; Radiation Hardening: No; Package Quantity: 1; Case/Package: Metal; Insulation Material: Plastic; Number of Terminals/Pins: 5; Packaging: Bulk; Contact Type: Pin; Series: -; Mount: Through Hole; Contact Plating: Nickel; Termination: Solder; Number of Positions: 5; Orientation: Right Angle; Lead Free: Lead Free; Color: Black; Fastening Type: Pull
J21 = 4208: Description; Manufacturer_Name: Adafruit Industries; Copyright: Copyright (C) 2025 Ultra Librarian. All rights reserved.; Manufacturer_Part_Number: 4208; RefDes: RefDes; Type: Type
Q9 = 6n137: Optocoupler, Darlington output (6N138 type), SO-8; Manufacturer: Broadcom; Manufacturer Part Number: HCPL-0700-000E; Min Supply Voltage: 4.5V; Forward Voltage: 1.5V; Turn Off Delay Time: 50ns; Standoff Height: 0.505mm; Reverse Voltage: 5V; Isolation Voltage: 3750Vrms; Forward Current: 10mA; Turn On Delay Time: 48ns; Max Supply Voltage: 5.5V; Package: 0; Automotive: No; Lead Free: Yes; ComponentLink2Description: Datasheet; Temperature: -40°C to +85°C; Device Class L3: unset; Height: 4.455mm; Ambient Temperature Range Low: -40°C; Digikey Description: OPTOISO 3.75KV OPN COLL 8DIP GW; Temperature Range Low: -40°C; ComponentLink2URL: https://docs.broadcom.com/docs/AV02-0940EN; Mouser Description: High Speed Optocouplers 10 Mb/s 3750Vrms; Category: Trans; Ambient Temperature Range High: +85°C; RoHS: TRUE; Octopart: https://octopart.com/search?q=HCPL-0700-000E; Device Class L1: Optoelectronics; Device Class L2: Optocouplers; Temperature Range High: +85°C
R89-R91 = Resistor: RES 10K OHM 0.1% 1/8W 0805

## Sheet DISPLAY.SchDoc
size A4; SheetNumber: 7; SheetTotal: 11
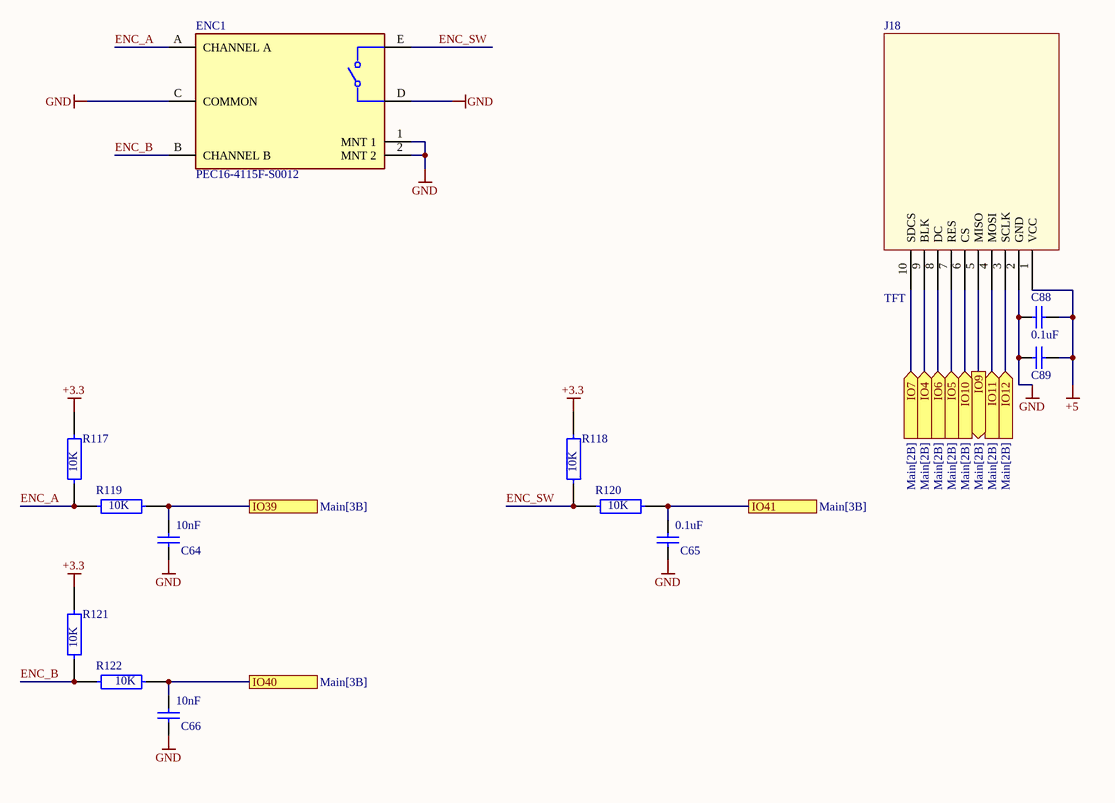
[diagram p6: DISPLAY.SchDoc]

### Parts
C64  10nF  [CAPC2013X145X48NL20T23]
C65  0.1uF  [CAPC2013X145X48NL20T23]
C66  10nF  [CAPC2013X145X48NL20T23]
C88  0.1uF  [CAPC2013X145X48NL20T23]
C89  10uF  [CAPC2013X145X48NL20T23]  (value not drawn)
ENC1  PEC16-4115F-S0012  [FP-PEC16-4115F-S0012-MFG]
J18  TFT  [DFR0664_TFT_1x10_P2.54_M2]
R117  10K  [FP-RN73R2A-IPC_A]
R118  10K  [FP-RN73R2A-IPC_A]
R119  10K  [FP-RN73R2A-IPC_A]
R120  10K  [FP-RN73R2A-IPC_A]
R121  10K  [FP-RN73R2A-IPC_A]
R122  10K  [FP-RN73R2A-IPC_A]

### Ports
IO4 (in, see Main[2B]), IO5 (in, see Main[2B]), IO6 (in, see Main[2B]), IO7 (in, see Main[2B]), IO9 (out, see Main[2B]), IO10 (in, see Main[2B]), IO11 (in, see Main[2B]), IO12 (in, see Main[2B]), IO39 (see Main[3B]), IO40 (see Main[3B]), IO41 (see Main[3B])

### Nets
+3.3: R117.2 R118.2 R121.2
+5: C88.2 C89.2 J18.1(VCC)
GND: C64.1 C65.1 C66.1 C88.1 C89.1 ENC1.1(MNT_1) ENC1.2(MNT_2) ENC1.C(COMMON) ENC1.D J18.2(GND)
ENC_A: ENC1.A(CHANNEL_A) R117.1 R119.2
ENC_B: ENC1.B(CHANNEL_B) R121.1 R122.2
ENC_SW: ENC1.E R118.1 R120.2
IO4: J18.9(BLK) ; port IO4
IO5: J18.7(RES) ; port IO5
IO6: J18.8(DC) ; port IO6
IO7: J18.10(SDCS) ; port IO7
IO9: J18.5(MISO) ; port IO9
IO10: J18.6(CS) ; port IO10
IO11: J18.4(MOSI) ; port IO11
IO12: J18.3(SCLK) ; port IO12
IO39: C64.2 R119.1 ; port IO39
IO40: C66.2 R122.1 ; port IO40
IO41: C65.2 R120.1 ; port IO41

### Library data of the parts
C64-C66 C88 C89 = CAP: as C37 on sheet DAC_LFO
ENC1 = ROTARY: ROTARY ENCODER MECHANICAL 12PPR; Pulses per Revolution: 12; Built in Switch: Yes; Output Type: Quadrature; Number of Channels: 2; Operating Supply Voltage: 5V; Min Operating Temperature: -30°C; Package Quantity: 50; Length: 23mm; Height: 17.3mm; Mount: Through Hole; Termination: PC Pin; Encoder Type: Mechanical; Max Operating Temperature: 70°C; Orientation: Vertical; RoHS Compliant: Yes; Series: PEC16; Width: 16mm; Detent: Yes
J18 = DFR0664
R117-R122 = Resistor: RES 10K OHM 0.1% 1/8W 0805

## Sheet POWER.SchDoc
size A4; SheetNumber: 8; SheetTotal: 11
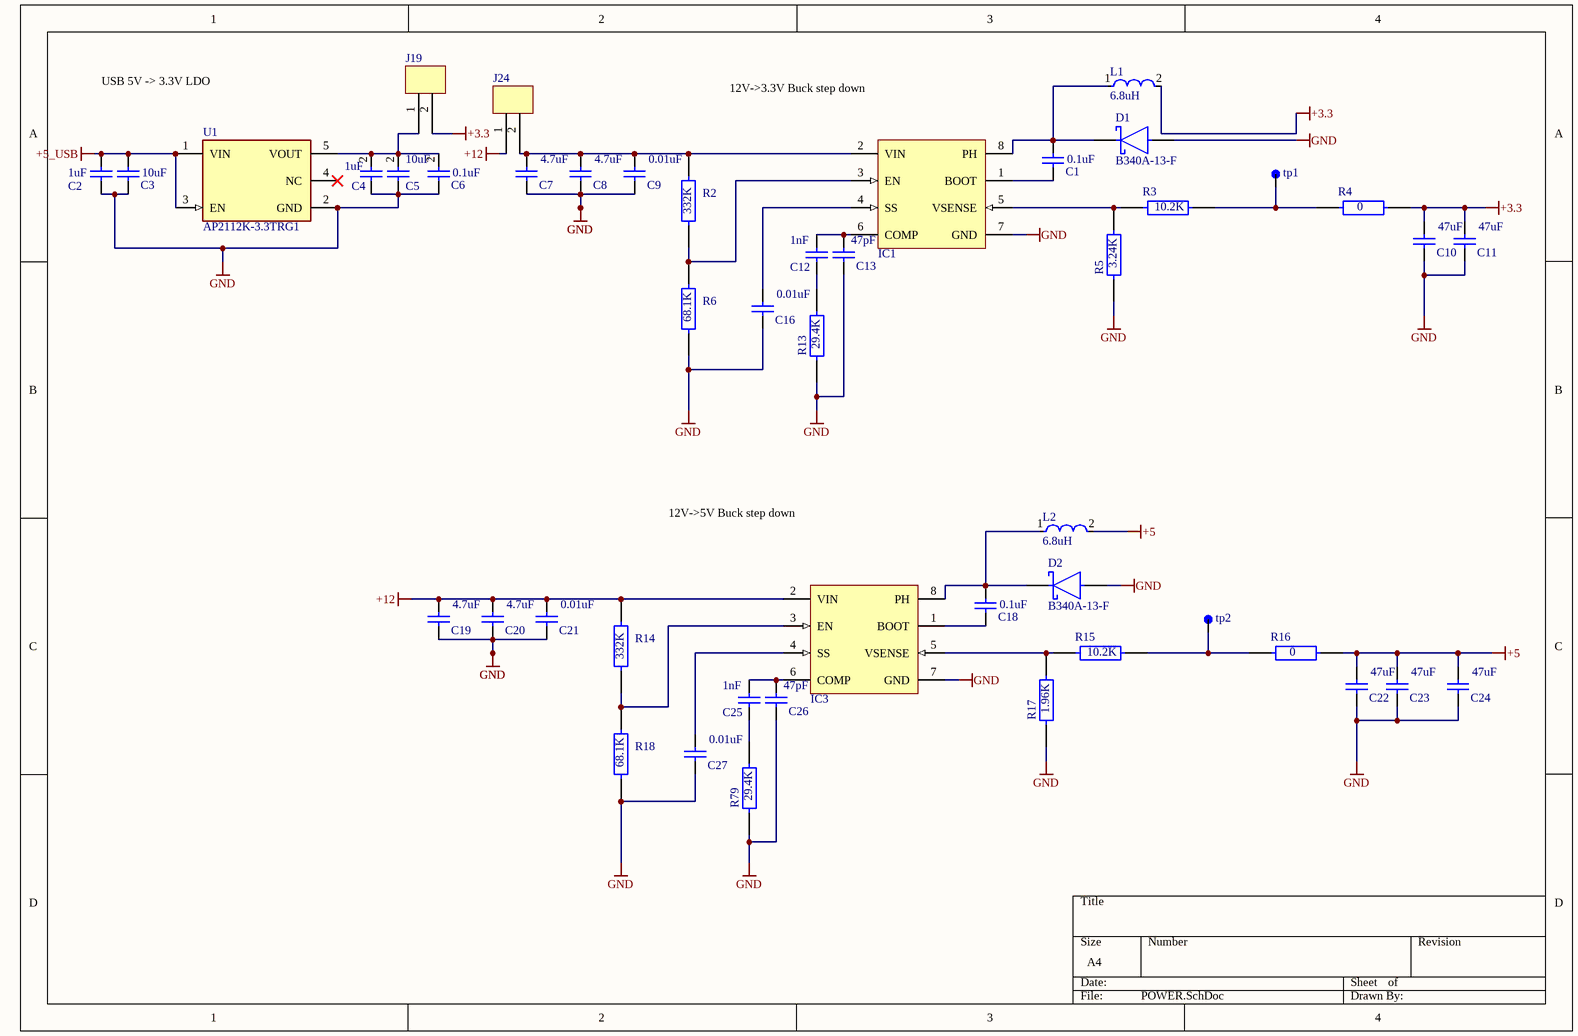
[diagram p7: POWER.SchDoc]

### Parts
C1  0.1uF  [CAPC2013X145X48NL20T23]
C2  1uF  [CAPC2013X145X48NL20T23]
C3  10uF  [CAPC2013X145X48NL20T23]
C4  1uF  [CAPC2013X145X48NL20T23]
C5  10uF  [CAPC2013X145X48NL20T23]
C6  0.1uF  [CAPC2013X145X48NL20T23]
C7  4.7uF  [CAPC2013X145X48NL20T23]
C8  4.7uF  [CAPC2013X145X48NL20T23]
C9  0.01uF  [CAPC2013X145X48NL20T23]
C10  47uF  [CAP_1210]
C11  47uF  [CAP_1210]
C12  1nF  [CAPC2013X145X48NL20T23]
C13  47pF  [CAPC2013X145X48NL20T23]
C16  0.01uF  [CAPC2013X145X48NL20T23]
C18  0.1uF  [CAPC2013X145X48NL20T23]
C19  4.7uF  [CAPC2013X145X48NL20T23]
C20  4.7uF  [CAPC2013X145X48NL20T23]
C21  0.01uF  [CAPC2013X145X48NL20T23]
C22  47uF  [CAP_1210]
C23  47uF  [CAP_1210]
C24  47uF  [CAP_1210]
C25  1nF  [CAPC2013X145X48NL20T23]
C26  47pF  [CAPC2013X145X48NL20T23]
C27  0.01uF  [CAPC2013X145X48NL20T23]
D1  B340A-13-F  [FP-SMA-MFG]
D2  B340A-13-F  [FP-SMA-MFG]
IC1  TPS54331DG4  [D8_N]  (value not drawn)
IC3  TPS54331DG4  [D8_N]  (value not drawn)
J19  Pinheader_1x2  [HDR_1x2_P2.54]  (value not drawn)
J24  Pinheader_1x2  [HDR_1x2_P2.54]  (value not drawn)
L1  6.8uH  [IND_SRN6045]
L2  6.8uH  [IND_SRN6045]
R2  332K  [FP-RN73R2A-IPC_A]
R3  10.2K  [FP-RN73R2A-IPC_A]
R4  0  [FP-RN73R2A-IPC_A]
R5  3.24K  [FP-RN73R2A-IPC_A]
R6  68.1K  [FP-RN73R2A-IPC_A]
R13  29.4K  [FP-RN73R2A-IPC_A]
R14  332K  [FP-RN73R2A-IPC_A]
R15  10.2K  [FP-RN73R2A-IPC_A]
R16  0  [FP-RN73R2A-IPC_A]
R17  1.96K  [FP-RN73R2A-IPC_A]
R18  68.1K  [FP-RN73R2A-IPC_A]
R79  29.4K  [FP-RN73R2A-IPC_A]
tp1  3.3V  [TP]  (value not drawn)
tp2  3.3V  [TP]  (value not drawn)
U1  AP2112K-3.3TRG1  [FP-SOT25-IPC_A]

### Nets
+3.3: C10.2 C11.2 J19.2 L1.2 R4.1
+5: C22.2 C23.2 C24.2 L2.2 R16.1
+5_USB: C2.2 C3.2 U1.1(VIN) U1.3(EN)
+12: C19.2 C20.2 C21.2 IC3.2(VIN) J24.1 R14.2
GND: C2.1 C3.1 C4.1 C5.1 C6.1 C7.1 C8.1 C9.1 C10.1 C11.1 C13.1 C16.1 C19.1 C20.1 C21.1 C22.1 C23.1 C24.1 C26.1 C27.1 D1.2(A) D2.2(A) IC1.7(GND) IC3.7(GND) R5.1 R6.1 R13.1 R17.1 R18.1 R79.1 U1.2(GND)
NetC1_1: C1.1 IC1.1(BOOT)
NetC1_2: C1.2 D1.1(C) IC1.8(PH) L1.1
NetC4_2: C4.2 C5.2 C6.2 J19.1 U1.5(VOUT)
NetC7_2: C7.2 C8.2 C9.2 IC1.2(VIN) J24.2 R2.2
NetC12_1: C12.1 R13.2
NetC12_2: C12.2 C13.2 IC1.6(COMP)
NetC16_2: C16.2 IC1.4(SS)
NetC18_1: C18.1 IC3.1(BOOT)
NetC18_2: C18.2 D2.1(C) IC3.8(PH) L2.1
NetC25_1: C25.1 R79.2
NetC25_2: C25.2 C26.2 IC3.6(COMP)
NetC27_2: C27.2 IC3.4(SS)
NetIC1_3: IC1.3(EN) R2.1 R6.2
NetIC1_5: IC1.5(VSENSE) R3.2 R5.2
NetIC3_3: IC3.3(EN) R14.1 R18.2
NetIC3_5: IC3.5(VSENSE) R15.2 R17.2
NetR3_1: R3.1 R4.2 tp1.1
NetR15_1: R15.1 R16.2 tp2.1

Not connected (* = marked no-connect by the designer): U1 4(NC)*

### Notes on the sheet
- USB 5V -> 3.3V LDO
- (near IC1) 12V->3.3V Buck step down
- 12V->5V Buck step down

### Library data of the parts
C1-C13 C16 C18-C27 = CAP: as C37 on sheet DAC_LFO
D1 D2 = SCHOTTKY: DIODE SCHOTTKY 40V 3A SMA; Max Forward Surge Current (Ifsm): 80A; Forward Voltage: 500mV; Polarity: Standard; Max Reverse Current: 500uA; Capacitance: 250pF; Element Configuration: Single; Mount: Surface Mount; Output Current: 3A; Radiation Hardening: No; Width: 2.92mm; Current Rating: 3A; Termination: SMD/SMT; Voltage: 40V; Series: -; Max Operating Temperature: 125°C; Current: 3A; Max Repetitive Reverse Voltage (Vrrm): 40V; Min Operating Temperature: -55°C; REACH SVHC: No SVHC; Number of Pins: 2; Average Rectified Current: 3A; Contact Plating: Tin; RoHS Compliant: Yes; Max Reverse Voltage (DC): 40V; Packaging: Tape and Reel; Height: 2.3mm; Length: 4.6mm; Case/Package: SMA; Weight: 0.002258oz; Peak Non-Repetitive Surge Current: 80A; Package Quantity: 5000; Lead Free: Lead Free; Forward Current: 3A; Voltage Rating (DC): 40V
IC1 IC3 = TPSS54331: Buck Step Down Regulator with 3.5 to 28 V Input and 0.8 to 25 V Output, -40 to 150 degC, 8-Pin SOIC (D), Green (RoHS & no Sb/Br); Manufacturer: Texas Instruments; Vin(Max)(V): 28; Vout(Min)(V): 0.8; Vin(Min)(V): 3.5; Duty Cycle(Max)(%): 90; Regulated Outputs(#): 1; SubFamily: Step-Down Regulator; Iq(Typ)(mA): 0.11; Iout(Max)(A): 3; Rating: Catalog; Vout(Max)(V): 25; PackageDescription: 8-Pin Plastic Small Outline Integrated Circuit, 4.9 x 3.9 mm, Pitch 1.27 mm Pitch; ComponentLink1Description: Datasheet; DatasheetVersion: SLVS839D; PackageReference: D8; ComponentLink1URL: http://www.ti.com/general/docs/lit/getliterature.tsp?genericPartNumber=TPS54331&fileType=pdf; Code_JEDEC: MS-012AA; ComponentLink2URL: http://www.ti.com/litv/pdf/msoi002j; PartNumber: TPS54331DG4; Switch Current Limit(Typ)(A): 3.5; Mounting Technology: Surface Mount; Eco-Plan: Green (RoHS & no Sb/Br); ComponentLink3URL: Samples URL:http://www.ti.com/product/tps54331#samples; ComponentLink3Description: URL Link1; Topology: Buck; PackageVersion: revM, Jun-2011; ComponentLink2Description: Package Specification
L1 L2 = Inductor: 6.8uH shielded power inductor 6x6 mm, Isat >= 2 A (e.g. Bourns SRN6045TA-6R8M); NexarPartId: 6751235; DC Resistance (DCR): 50mΩ; Max DC Current: 2A; Self Resonant Frequency: 1.2GHz; Tolerance: 2%; Inductance: 110nH; Test Frequency: 7.9MHz; Q Factor: 19; Core Material: Ceramic, Ferrite; Length: 2.29mm; Termination: SMD/SMT; Weight: 5.499807mg; RoHS: Compliant; Ambient Temperature Range High: 85°C; RMS Current (Irms): 2A; Height: 1.6mm; Lifecycle Status: Production; Case/Package: 0805; Series Resistance: 50mΩ; Min Operating Temperature: -40°C; Composition: Wirewound; Max Operating Temperature: 85°C; Lead Free: Contains Lead; Width: 1.91mm
R2-R6 R13-R18 R79 = Resistor: RES 10K OHM 0.1% 1/8W 0805
tp1 tp2 = Testpoint: Value: Test point
U1 = CMP-12756-000035-1: IC REG LINEAR 3.3V 600MA SOT25; Number of Regulators: 1; Output Type: Fixed; Polarity: Positive; Min Input Voltage: 2.5V; Max Input Voltage: 6V; Accuracy: 1.5%; Quiescent Current: 55uA; Dropout Voltage: 250mV; Min Operating Temperature: -40°C; Length: 3.1mm; Output Current: 600mA; Max Operating Temperature: 85°C; Package Quantity: 1; Output Voltage: 3.3V; Width: 1.7mm; Number of Outputs: 1; Packaging: Tape and Reel; Height: 1.3mm; Lead Free: Lead Free; Max Output Current: 600mA; Case/Package: SOT-23-5; Mount: Surface Mount; Number of Pins: 5

## Sheet ADC.SchDoc
size A4; SheetNumber: 9; SheetTotal: 12
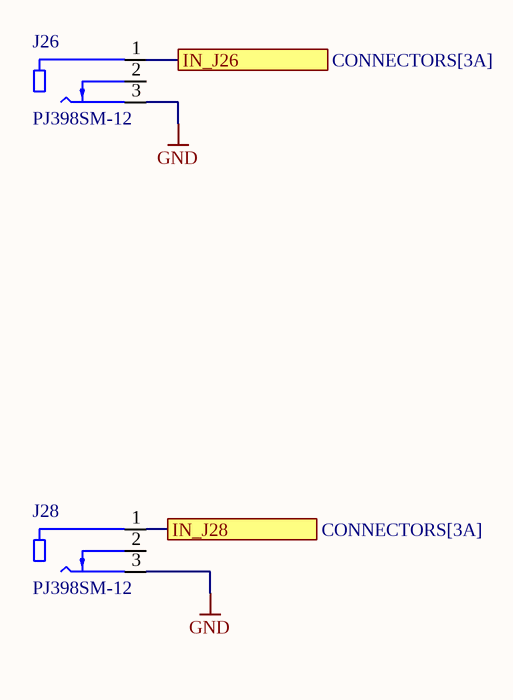
[diagram p8: ADC.SchDoc]

### Parts
J26  PJ398SM-12  [THONK_PJ398SM-12]
J28  PJ398SM-12  [THONK_PJ398SM-12]

### Ports
IN_J26 (see CONNECTORS[3A]), IN_J28 (see CONNECTORS[3A])

### Nets
GND: J26.3 J28.3
IN_J26: J26.1 ; port IN_J26
IN_J28: J28.1 ; port IN_J28

Not connected (* = marked no-connect by the designer): J26 2; J28 2

### Library data of the parts
J26 J28 = PJ398SM-12: 3.5mm Switching Jack Socket; MF: Thonk; Availability: Not in stock; Price: None; Package: Package; MP: PJ398SM-12; Value: *

## Sheet POWER_CONNECTOR.SchDoc
size A4; SheetNumber: 10; SheetTotal: 11
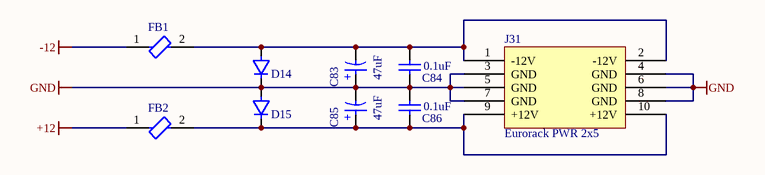
[diagram p9: POWER_CONNECTOR.SchDoc]

### Parts
C83  47uF  [WCAP-ASLI_D4H5.5]
C84  0.1uF  [CAPC2013X145X48NL20T23]
C85  47uF  [WCAP-ASLI_D4H5.5]
C86  0.1uF  [CAPC2013X145X48NL20T23]
D14  1N4148WS  [4148]  (value not drawn)
D15  1N4148WS  [4148]  (value not drawn)
FB1  BLM21PG600BH1D  [0805-hs]  (value not drawn)
FB2  BLM21PG600BH1D  [0805-hs]  (value not drawn)
J31  Eurorack PWR 2x5  [EURORACK_PWR_2x5_P2.54_SHROUDED]

### Nets
+12: FB2.1
-12: FB1.1
GND: C83.1(P) C84.1 C85.2(N) C86.2 D14.1(C) D15.2(A) J31.3(GND) J31.4(GND) J31.5(GND) J31.6(GND) J31.7(GND) J31.8(GND)
NetC83_2: C83.2(N) C84.2 D14.2(A) FB1.2 J31.1(-12V) J31.2(-12V)
NetC85_1: C85.1(P) C86.1 D15.1(C) FB2.2 J31.9(+12V) J31.10(+12V)

### Notes on the sheet
- (in symbol Cap_polarized) +

### Library data of the parts
C83 C85 = Cap_polarized: WCAP-ASLI Aluminum Electrolytic Capacitors; Ripple Current: 80mA; Voltage Rating (DC): 16V; Impedance: 2.2Ω; Tolerance: 20%; ESR (Equivalent Series Resistance): 1.66693Ω; Polarity: Polar; Leakage Current: 3µA; Capacitance: 10µF; Life (Hours): 2000hours; Insulation Resistance: 5.33333MΩ; Mount: Surface Mount; RoHS: Compliant; Ripple Current (AC): 80mA; REACH SVHC: Unknown; Lead Free: Lead Free; Max Operating Temperature: 105°C; Case/Package: Radial; Diameter: 4mm; Min Operating Temperature: -55°C; Length: 5.5mm; Width: 4.3mm; Height - Seated (Max): 5.5118mm; Voltage Rating: 16V; Height: 5.5mm
C84 C86 = CAP: as C37 on sheet DAC_LFO
D14 D15 = 4148WS: as D11 on sheet MIDI; Package Quantity: 1; Number of Pins: 2; Height: 1mm; REACH SVHC: No SVHC; Max Reverse Voltage (DC): 75V; Forward Current: 150mA; Length: 1.8mm; Max Repetitive Reverse Voltage (Vrrm): 75V; Max Operating Temperature: 150°C; Average Rectified Current: 150mA; Contact Plating: Tin; Packaging: Tape and Reel; Radiation Hardening: No; Min Operating Temperature: -55°C; Width: 1.35mm; Weight: 0.0276g; Lead Free: Lead Free; Mount: Surface Mount; Reverse Voltage: 75V; Reverse Recovery Time: 4ns
FB1 FB2 = Ferrite: Chip Ferrite Bead, 0805, 60Ω @ 100MHz, 0.02Ω, 25%, 1.9A; RoHS Compliant: No
J31 = EURORACK_PWR_2x5: Eurorack power header 2x5 shrouded. Pin 1-2 -12V (red stripe), 3-8 GND, 9-10 +12V

## Sheet MENU_BUTTONS.SchDoc
size A4; SheetNumber: 11; SheetTotal: 12
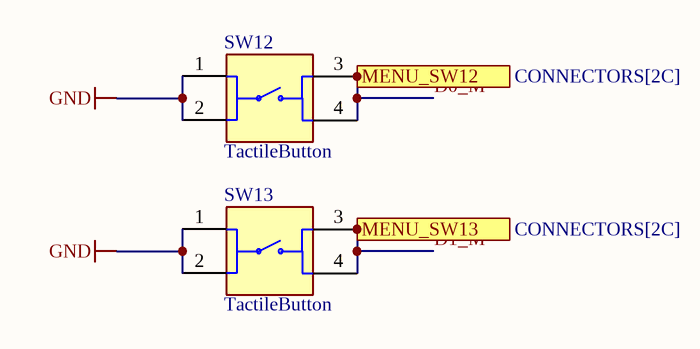
[diagram p10: MENU_BUTTONS.SchDoc]

### Parts
SW12  TactileButton  [KS01_B_12MM]
SW13  TactileButton  [KS01_B_12MM]

### Ports
MENU_SW12 (see CONNECTORS[2C]), MENU_SW13 (see CONNECTORS[2C])

### Nets
GND: SW12.1 SW12.2 SW13.1 SW13.2
D0_M: SW12.3 SW12.4 ; port MENU_SW12
D1_M: SW13.3 SW13.4 ; port MENU_SW13

### Library data of the parts
SW12 SW13 = TactileButton: as SW4 on sheet MUTE_BUTTONS; SnapEDA_Link: https://www.snapeda.com/parts/1825910-6/TE+Connectivity+Alcoswitch+Switches/view-part/?ref=snap; Package: None; Value: *; Check_prices: https://www.snapeda.com/parts/1825910-6/TE+Connectivity+Alcoswitch+Switches/view-part/?ref=eda

## Sheet CONNECTORS.SchDoc
size A4; SheetNumber: 12; SheetTotal: 12
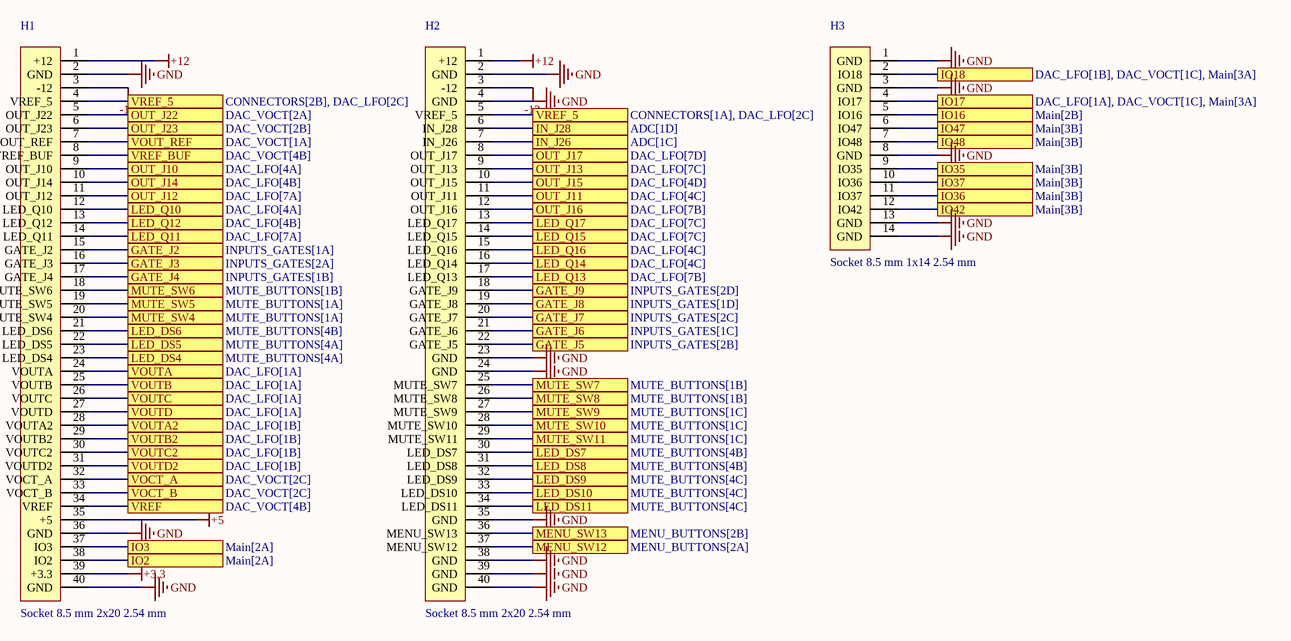
[diagram p11: CONNECTORS.SchDoc]

### Parts
H1  Socket 8.5 mm 2x20 2.54 mm  [HDR_2x20_P2.54_S]
H2  Socket 8.5 mm 2x20 2.54 mm  [HDR_2x20_P2.54_S]
H3  Socket 8.5 mm 1x14 2.54 mm  [HDR_1x14_P2.54]

### Ports
GATE_J2 (see INPUTS_GATES[1A]), GATE_J3 (see INPUTS_GATES[2A]), GATE_J4 (see INPUTS_GATES[1B]), GATE_J5 (see INPUTS_GATES[2B]), GATE_J6 (see INPUTS_GATES[1C]), GATE_J7 (see INPUTS_GATES[2C]), GATE_J8 (see INPUTS_GATES[1D]), GATE_J9 (see INPUTS_GATES[2D]), IN_J26 (see ADC[1C]), IN_J28 (see ADC[1D]), IO2 (see Main[2A]), IO3 (see Main[2A]), IO16 (see Main[2B]), IO17 (see DAC_LFO[1A], DAC_VOCT[1C], Main[3A]), IO18 (see DAC_LFO[1B], DAC_VOCT[1C], Main[3A]), IO35 (see Main[3B]), IO36 (see Main[3B]), IO37 (see Main[3B]), IO42 (see Main[3B]), IO47 (see Main[3B]), IO48 (see Main[3B]), LED_DS4 (see MUTE_BUTTONS[4A]), LED_DS5 (see MUTE_BUTTONS[4A]), LED_DS6 (see MUTE_BUTTONS[4B]), LED_DS7 (see MUTE_BUTTONS[4B]), LED_DS8 (see MUTE_BUTTONS[4B]), LED_DS9 (see MUTE_BUTTONS[4C]), LED_DS10 (see MUTE_BUTTONS[4C]), LED_DS11 (see MUTE_BUTTONS[4C]), LED_Q10 (see DAC_LFO[4A]), LED_Q11 (see DAC_LFO[7A]), LED_Q12 (see DAC_LFO[4B]), LED_Q13 (see DAC_LFO[7B]), LED_Q14 (see DAC_LFO[4C]), LED_Q15 (see DAC_LFO[7C]), LED_Q16 (see DAC_LFO[4C]), LED_Q17 (see DAC_LFO[7C]), MENU_SW12 (see MENU_BUTTONS[2A]), MENU_SW13 (see MENU_BUTTONS[2B]), MUTE_SW4 (see MUTE_BUTTONS[1A]), MUTE_SW5 (see MUTE_BUTTONS[1A]), MUTE_SW6 (see MUTE_BUTTONS[1B]), MUTE_SW7 (see MUTE_BUTTONS[1B]), MUTE_SW8 (see MUTE_BUTTONS[1B]), MUTE_SW9 (see MUTE_BUTTONS[1C]), MUTE_SW10 (see MUTE_BUTTONS[1C]), MUTE_SW11 (see MUTE_BUTTONS[1C]), OUT_J10 (see DAC_LFO[4A]), OUT_J11 (see DAC_LFO[4C]), OUT_J12 (see DAC_LFO[7A]), OUT_J13 (see DAC_LFO[7C]), OUT_J14 (see DAC_LFO[4B]), OUT_J15 (see DAC_LFO[4D]), OUT_J16 (see DAC_LFO[7B]), OUT_J17 (see DAC_LFO[7D]), OUT_J22 (see DAC_VOCT[2A]), OUT_J23 (see DAC_VOCT[2B]), VOCT_A (see DAC_VOCT[2C]), VOCT_B (see DAC_VOCT[2C]), VOUT_REF (see DAC_VOCT[1A]), VOUTA2 (see DAC_LFO[1B]), VOUTA (see DAC_LFO[1A]), VOUTB2 (see DAC_LFO[1B]), VOUTB (see DAC_LFO[1A]), VOUTC2 (see DAC_LFO[1B]), VOUTC (see DAC_LFO[1A]), VOUTD2 (see DAC_LFO[1B]), VOUTD (see DAC_LFO[1A]), VREF (see DAC_VOCT[4B]), VREF_5 (see CONNECTORS[1A], DAC_LFO[2C]), VREF_5 (see CONNECTORS[2B], DAC_LFO[2C]), VREF_BUF (see DAC_VOCT[4B])

### Nets
+3.3: H1.39(+3.3)
+5: H1.35(+5)
+12: H1.1(+12) H2.1(+12)
-12: H1.3(-12) H2.3(-12)
GND: H1.2(GND) H1.36(GND) H1.40(GND) H2.2(GND) H2.4(GND) H2.23(GND) H2.24(GND) H2.35(GND) H2.38(GND) H2.39(GND) H2.40(GND) H3.1(GND) H3.3(GND) H3.8(GND) H3.13(GND) H3.14(GND)
D0_L: H1.20(MUTE_SW4) ; port MUTE_SW4
D0_M: H2.37(MENU_SW12) ; port MENU_SW12
D1_L: H1.19(MUTE_SW5) ; port MUTE_SW5
D1_M: H2.36(MENU_SW13) ; port MENU_SW13
D2_L: H1.18(MUTE_SW6) ; port MUTE_SW6
D3_L: H2.25(MUTE_SW7) ; port MUTE_SW7
D4_L: H2.26(MUTE_SW8) ; port MUTE_SW8
D5_L: H2.27(MUTE_SW9) ; port MUTE_SW9
D6_L: H2.28(MUTE_SW10) ; port MUTE_SW10
D7_L: H2.29(MUTE_SW11) ; port MUTE_SW11
GATE_J2: H1.15(GATE_J2) ; port GATE_J2
GATE_J3: H1.16(GATE_J3) ; port GATE_J3
GATE_J4: H1.17(GATE_J4) ; port GATE_J4
GATE_J5: H2.22(GATE_J5) ; port GATE_J5
GATE_J6: H2.21(GATE_J6) ; port GATE_J6
GATE_J7: H2.20(GATE_J7) ; port GATE_J7
GATE_J8: H2.19(GATE_J8) ; port GATE_J8
GATE_J9: H2.18(GATE_J9) ; port GATE_J9
IN_J26: H2.7(IN_J26) ; port IN_J26
IN_J28: H2.6(IN_J28) ; port IN_J28
IO2: H1.38(IO2) ; port IO2
IO3: H1.37(IO3) ; port IO3
IO16: H3.5(IO16) ; port IO16
IO17: H3.4(IO17) ; port IO17
IO18: H3.2(IO18) ; port IO18
IO35: H3.9(IO35) ; port IO35
IO36: H3.11(IO37) ; port IO36
IO37: H3.10(IO36) ; port IO37
IO42: H3.12(IO42) ; port IO42
IO47: H3.6(IO47) ; port IO47
IO48: H3.7(IO48) ; port IO48
LED_DS4: H1.23(LED_DS4) ; port LED_DS4
LED_DS5: H1.22(LED_DS5) ; port LED_DS5
LED_DS6: H1.21(LED_DS6) ; port LED_DS6
LED_DS7: H2.30(LED_DS7) ; port LED_DS7
LED_DS8: H2.31(LED_DS8) ; port LED_DS8
LED_DS9: H2.32(LED_DS9) ; port LED_DS9
LED_DS10: H2.33(LED_DS10) ; port LED_DS10
LED_DS11: H2.34(LED_DS11) ; port LED_DS11
LED_Q10: H1.12(LED_Q10) ; port LED_Q10
LED_Q11: H1.14(LED_Q11) ; port LED_Q11
LED_Q12: H1.13(LED_Q12) ; port LED_Q12
LED_Q13: H2.17(LED_Q13) ; port LED_Q13
LED_Q14: H2.16(LED_Q14) ; port LED_Q14
LED_Q15: H2.14(LED_Q15) ; port LED_Q15
LED_Q16: H2.15(LED_Q16) ; port LED_Q16
LED_Q17: H2.13(LED_Q17) ; port LED_Q17
OUT_J10: H1.9(OUT_J10) ; port OUT_J10
OUT_J11: H2.11(OUT_J11) ; port OUT_J11
OUT_J12: H1.11(OUT_J12) ; port OUT_J12
OUT_J13: H2.9(OUT_J13) ; port OUT_J13
OUT_J14: H1.10(OUT_J14) ; port OUT_J14
OUT_J15: H2.10(OUT_J15) ; port OUT_J15
OUT_J16: H2.12(OUT_J16) ; port OUT_J16
OUT_J17: H2.8(OUT_J17) ; port OUT_J17
OUT_J22: H1.5(OUT_J22) ; port OUT_J22
OUT_J23: H1.6(OUT_J23) ; port OUT_J23
VOCT_A: H1.32(VOCT_A) ; port VOCT_A
VOCT_B: H1.33(VOCT_B) ; port VOCT_B
VOUT_REF: H1.7(VOUT_REF) ; port VOUT_REF
VOUTA: H1.24(VOUTA) ; port VOUTA
VOUTA2: H1.28(VOUTA2) ; port VOUTA2
VOUTB: H1.25(VOUTB) ; port VOUTB
VOUTB2: H1.29(VOUTB2) ; port VOUTB2
VOUTC: H1.26(VOUTC) ; port VOUTC
VOUTC2: H1.30(VOUTC2) ; port VOUTC2
VOUTD: H1.27(VOUTD) ; port VOUTD
VOUTD2: H1.31(VOUTD2) ; port VOUTD2
VREF: H1.34(VREF) ; port VREF
VREF_5: H1.4(VREF_5) H2.5(VREF_5) ; port VREF_5
VREF_BUF: H1.8(VREF_BUF) ; port VREF_BUF

### Library data of the parts
H1 H2 = Header_2x20
H3 = Header_1x14

## Nets that join several sheets
+3.3: Main (6 pins), MIDI (C40.2 J21.2 Q9.8 R89.2), DISPLAY (R117.2 R118.2 R121.2), POWER (5 pins), CONNECTORS (H1.39)
+5: DAC_LFO (8 pins), DAC_VOCT (C62.2 C63.2 IC10.14), Main (R10.1), MUTE_BUTTONS (8 pins), DISPLAY (C88.2 C89.2 J18.1), POWER (5 pins), CONNECTORS (H1.35)
+5_USB: Main (J1.A4-B9 J1.B4-A9), POWER (C2.2 C3.2 U1.1 U1.3)
+5A: DAC_LFO (8 pins), DAC_VOCT (C28.2 C29.2 IC4.9 R19.2)
+12: DAC_LFO (C90.2 R116.1 U2.1 U2.3), POWER (6 pins), POWER_CONNECTOR (FB2.1), CONNECTORS (H1.1 H2.1)
-12: POWER_CONNECTOR (FB1.1), CONNECTORS (H1.3 H2.3)
GND: INPUTS_GATES (8 pins), DAC_LFO (37 pins), DAC_VOCT (16 pins), Main (18 pins), MUTE_BUTTONS (16 pins), MIDI (C40.1 J21.1 Q9.5 R91.1), DISPLAY (10 pins), POWER (31 pins), ADC (J26.3 J28.3), POWER_CONNECTOR (12 pins), MENU_BUTTONS (SW12.1 SW12.2 SW13.1 SW13.2), CONNECTORS (16 pins)
D0_L: MUTE_BUTTONS (SW4.3 SW4.4), CONNECTORS (H1.20)
D0_M: MENU_BUTTONS (SW12.3 SW12.4), CONNECTORS (H2.37)
D1_L: MUTE_BUTTONS (SW5.3 SW5.4), CONNECTORS (H1.19)
D1_M: MENU_BUTTONS (SW13.3 SW13.4), CONNECTORS (H2.36)
D2_L: MUTE_BUTTONS (SW6.3 SW6.4), CONNECTORS (H1.18)
D3_L: MUTE_BUTTONS (SW7.3 SW7.4), CONNECTORS (H2.25)
D4_L: MUTE_BUTTONS (SW8.3 SW8.4), CONNECTORS (H2.26)
D5_L: MUTE_BUTTONS (SW9.3 SW9.4), CONNECTORS (H2.27)
D6_L: MUTE_BUTTONS (SW10.3 SW10.4), CONNECTORS (H2.28)
D7_L: MUTE_BUTTONS (SW11.3 SW11.4), CONNECTORS (H2.29)
GATE_J2: INPUTS_GATES (J2.1), CONNECTORS (H1.15)
GATE_J3: INPUTS_GATES (J3.1), CONNECTORS (H1.16)
GATE_J4: INPUTS_GATES (J4.1), CONNECTORS (H1.17)
GATE_J5: INPUTS_GATES (J5.1), CONNECTORS (H2.22)
GATE_J6: INPUTS_GATES (J6.1), CONNECTORS (H2.21)
GATE_J7: INPUTS_GATES (J7.1), CONNECTORS (H2.20)
GATE_J8: INPUTS_GATES (J8.1), CONNECTORS (H2.19)
GATE_J9: INPUTS_GATES (J9.1), CONNECTORS (H2.18)
IN_J26: ADC (J26.1), CONNECTORS (H2.7)
IN_J28: ADC (J28.1), CONNECTORS (H2.6)
IO2: Main (IC2.38), CONNECTORS (H1.38)
IO3: Main (IC2.15), CONNECTORS (H1.37)
IO4: Main (IC2.4), DISPLAY (J18.9)
IO5: Main (IC2.5), DISPLAY (J18.7)
IO6: Main (IC2.6), DISPLAY (J18.8)
IO7: Main (IC2.7), DISPLAY (J18.10)
IO8: DAC_VOCT (IC10.5), Main (IC2.12)
IO9: Main (IC2.17), DISPLAY (J18.5)
IO10: Main (IC2.18), DISPLAY (J18.6)
IO11: Main (IC2.19), DISPLAY (J18.4)
IO12: Main (IC2.20), DISPLAY (J18.3)
IO13: Main (IC2.21), MIDI (Q9.6 R89.1)
IO14: Main (IC2.22), MIDI (J21.4)
IO15: DAC_LFO (IC7.9), Main (IC2.8)
IO16: Main (IC2.9), CONNECTORS (H3.5)
IO17: DAC_LFO (IC7.8 IC11.8), DAC_VOCT (IC10.12), Main (IC2.10), CONNECTORS (H3.4)
IO18: DAC_LFO (IC7.10 IC11.10), DAC_VOCT (IC10.9), Main (R1.1), CONNECTORS (H3.2)
IO21: DAC_LFO (IC11.9), Main (IC2.23)
IO35: Main (R20.1), CONNECTORS (H3.9)
IO36: Main (R21.1), CONNECTORS (H3.11)
IO37: Main (IC2.30), CONNECTORS (H3.10)
IO38: Main (IC2.31), MIDI (J21.3)
IO39: Main (IC2.32), DISPLAY (C64.2 R119.1)
IO40: Main (IC2.33), DISPLAY (C66.2 R122.1)
IO41: Main (IC2.34), DISPLAY (C65.2 R120.1)
IO42: Main (IC2.35), CONNECTORS (H3.12)
IO47: Main (IC2.24), CONNECTORS (H3.6)
IO48: Main (IC2.25), CONNECTORS (H3.7)
LED_DS4: MUTE_BUTTONS (DS4.2), CONNECTORS (H1.23)
LED_DS5: MUTE_BUTTONS (DS5.2), CONNECTORS (H1.22)
LED_DS6: MUTE_BUTTONS (DS6.2), CONNECTORS (H1.21)
LED_DS7: MUTE_BUTTONS (DS7.2), CONNECTORS (H2.30)
LED_DS8: MUTE_BUTTONS (DS8.2), CONNECTORS (H2.31)
LED_DS9: MUTE_BUTTONS (DS9.2), CONNECTORS (H2.32)
LED_DS10: MUTE_BUTTONS (DS10.2), CONNECTORS (H2.33)
LED_DS11: MUTE_BUTTONS (DS11.2), CONNECTORS (H2.34)
LED_Q10: DAC_LFO (Q10.1 R94.1), CONNECTORS (H1.12)
LED_Q11: DAC_LFO (Q11.1 R95.1), CONNECTORS (H1.14)
LED_Q12: DAC_LFO (Q12.1 R100.1), CONNECTORS (H1.13)
LED_Q13: DAC_LFO (Q13.1 R101.1), CONNECTORS (H2.17)
LED_Q14: DAC_LFO (Q14.1 R106.1), CONNECTORS (H2.16)
LED_Q15: DAC_LFO (Q15.1 R107.1), CONNECTORS (H2.14)
LED_Q16: DAC_LFO (Q16.1 R112.1), CONNECTORS (H2.15)
LED_Q17: DAC_LFO (Q17.1 R113.1), CONNECTORS (H2.13)
OUT_J10: DAC_LFO (J10.1), CONNECTORS (H1.9)
OUT_J11: DAC_LFO (J11.1), CONNECTORS (H2.11)
OUT_J12: DAC_LFO (J12.1), CONNECTORS (H1.11)
OUT_J13: DAC_LFO (J13.1), CONNECTORS (H2.9)
OUT_J14: DAC_LFO (J14.1), CONNECTORS (H1.10)
OUT_J15: DAC_LFO (J15.1), CONNECTORS (H2.10)
OUT_J16: DAC_LFO (J16.1), CONNECTORS (H2.12)
OUT_J17: DAC_LFO (J17.1), CONNECTORS (H2.8)
OUT_J22: DAC_VOCT (J22.1), CONNECTORS (H1.5)
OUT_J23: DAC_VOCT (J23.1), CONNECTORS (H1.6)
VOCT_A: DAC_VOCT (IC4.1), CONNECTORS (H1.32)
VOCT_B: DAC_VOCT (IC4.2), CONNECTORS (H1.33)
VOUT_REF: DAC_VOCT (SW3.2), CONNECTORS (H1.7)
VOUTA: DAC_LFO (IC7.2), CONNECTORS (H1.24)
VOUTA2: DAC_LFO (IC11.2), CONNECTORS (H1.28)
VOUTB: DAC_LFO (IC7.3), CONNECTORS (H1.25)
VOUTB2: DAC_LFO (IC11.3), CONNECTORS (H1.29)
VOUTC: DAC_LFO (IC7.4), CONNECTORS (H1.26)
VOUTC2: DAC_LFO (IC11.4), CONNECTORS (H1.30)
VOUTD: DAC_LFO (IC7.5), CONNECTORS (H1.27)
VOUTD2: DAC_LFO (IC11.5), CONNECTORS (H1.31)
VREF: DAC_VOCT (C82.1 IC4.10 tp8.1), CONNECTORS (H1.34)
VREF_5: DAC_LFO (6 pins), CONNECTORS (H1.4 H2.5)
VREF_BUF: DAC_VOCT (SW3.1 tp7.1), CONNECTORS (H1.8)